# Altium project ESP32-ANALOG BOARD.PrjPcb
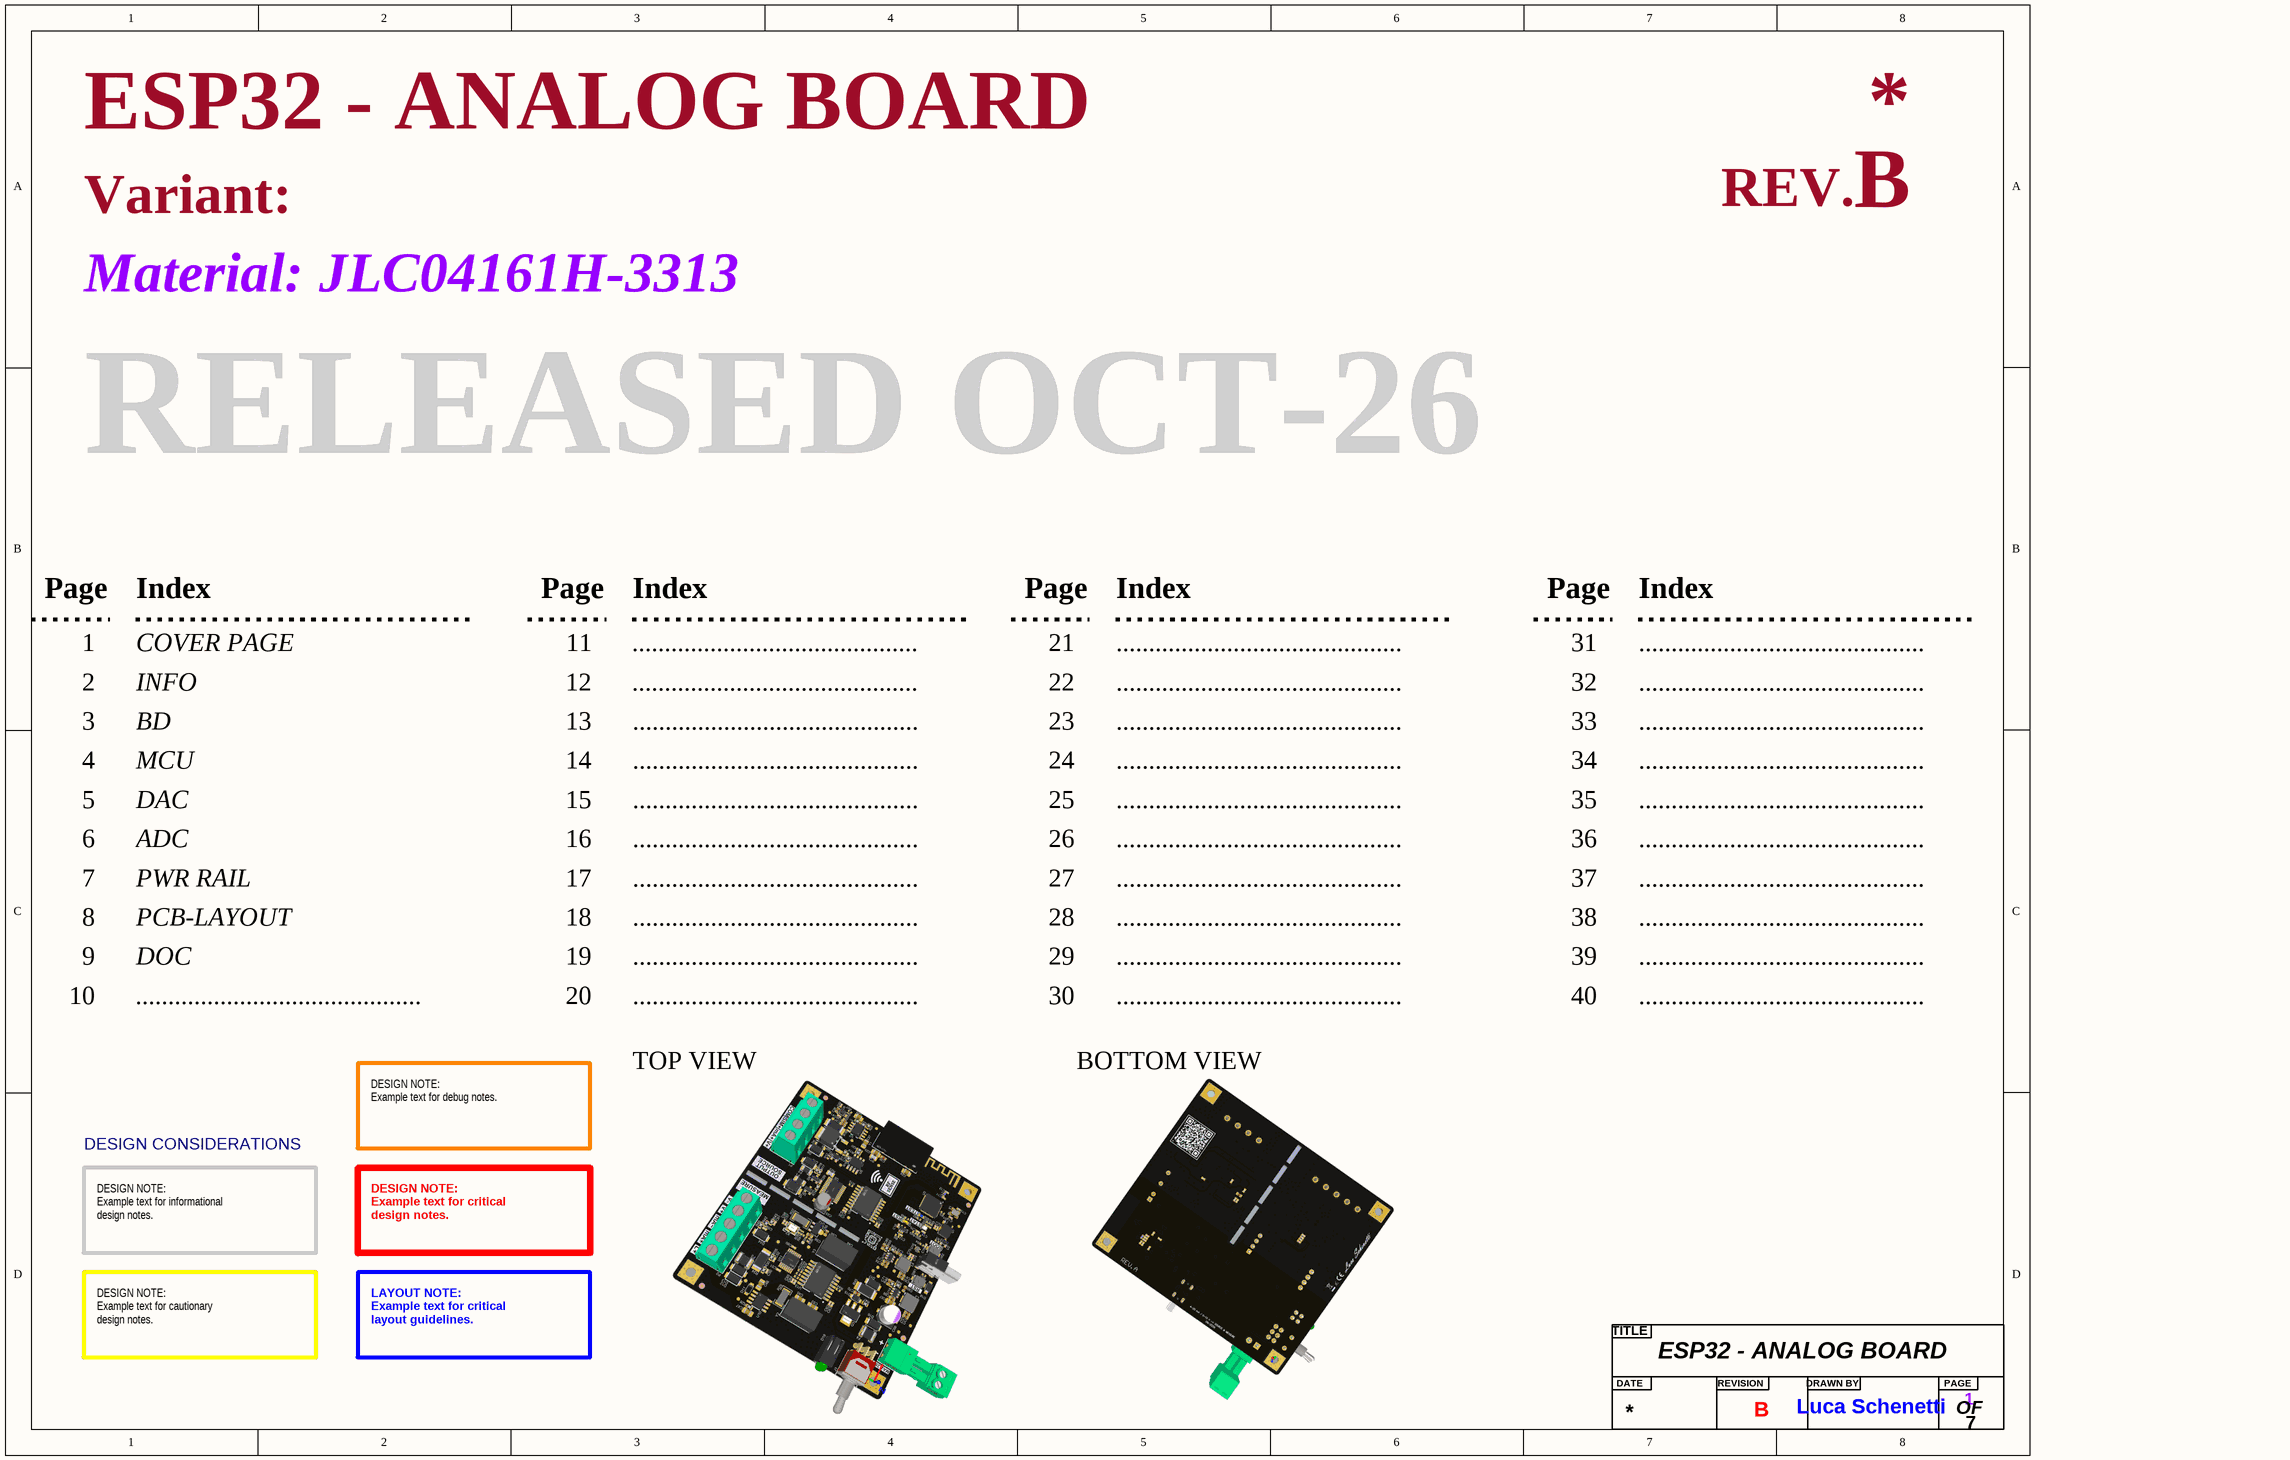
[diagram p0: COVER PAGE.SchDoc]
7 sheets, 231 parts. Net scope: flat (ports and power ports of the same name join across sheets).
Board file: PCB-LAYOUT.PcbDoc
Sheets:
  COVER PAGE.SchDoc
  INFO.SchDoc
  BD.SchDoc
  MCU.SchDoc
  DAC.SchDoc
  ADC.SchDoc
  PWR RAIL.SchDoc

## Sheet COVER PAGE.SchDoc: ESP32 - ANALOG BOARD
size A3; Author: Luca Schenetti; DrawnBy: Luca Schenetti; Engineer: Luca Schenetti; Revision: B; SheetNumber: 1; SheetTotal: 7; Material: JLC04161H-3313

### Parts
(Parts that share a designator on the sheet are numbered #1, #2 ... from top to bottom, then left to right.)
?#1  Title  (value not drawn)  (graphical)

### Notes on the sheet
- Variant:
- REV.
- Material:
- RELEASED OCT-26
- Page
- Index
- 1
- 2
- COVER PAGE
- INFO
- 11
- 12
- ............................................
- 21
- 22
- 31
- 32
- 3
- BD
- 13
- 23
- 33
- 4
- 5
- MCU
- DAC
- 14
- 15
- 24
- 25
- 34
- 35
- 6
- 7
- PWR RAIL
- ADC
- 16
- 17
- 26
- 27
- 36
- 37
- 8
- PCB-LAYOUT
- 18
- 28
- 38
- 9
- 10
- DOC
- 19
- 20
- 29
- 30
- 39
- 40
- TOP VIEW
- BOTTOM VIEW
- DESIGN CONSIDERATIONS
- DESIGN NOTE:
  Example text for debug notes.
- DESIGN NOTE:
  Example text for informational
  design notes.
- DESIGN NOTE:
  Example text for critical
  design notes.
- DESIGN NOTE:
  Example text for cautionary
  design notes.
- LAYOUT NOTE:
  Example text for critical
  layout guidelines.
- (in symbol Title) TITLE; DATE; REVISION; DRAWN BY; PAGE; OF

## Sheet INFO.SchDoc: ESP32 - ANALOG BOARD
size A3; Revision: B; Author: Luca Schenetti; DrawnBy: Luca Schenetti; SheetNumber: 2; SheetTotal: 7
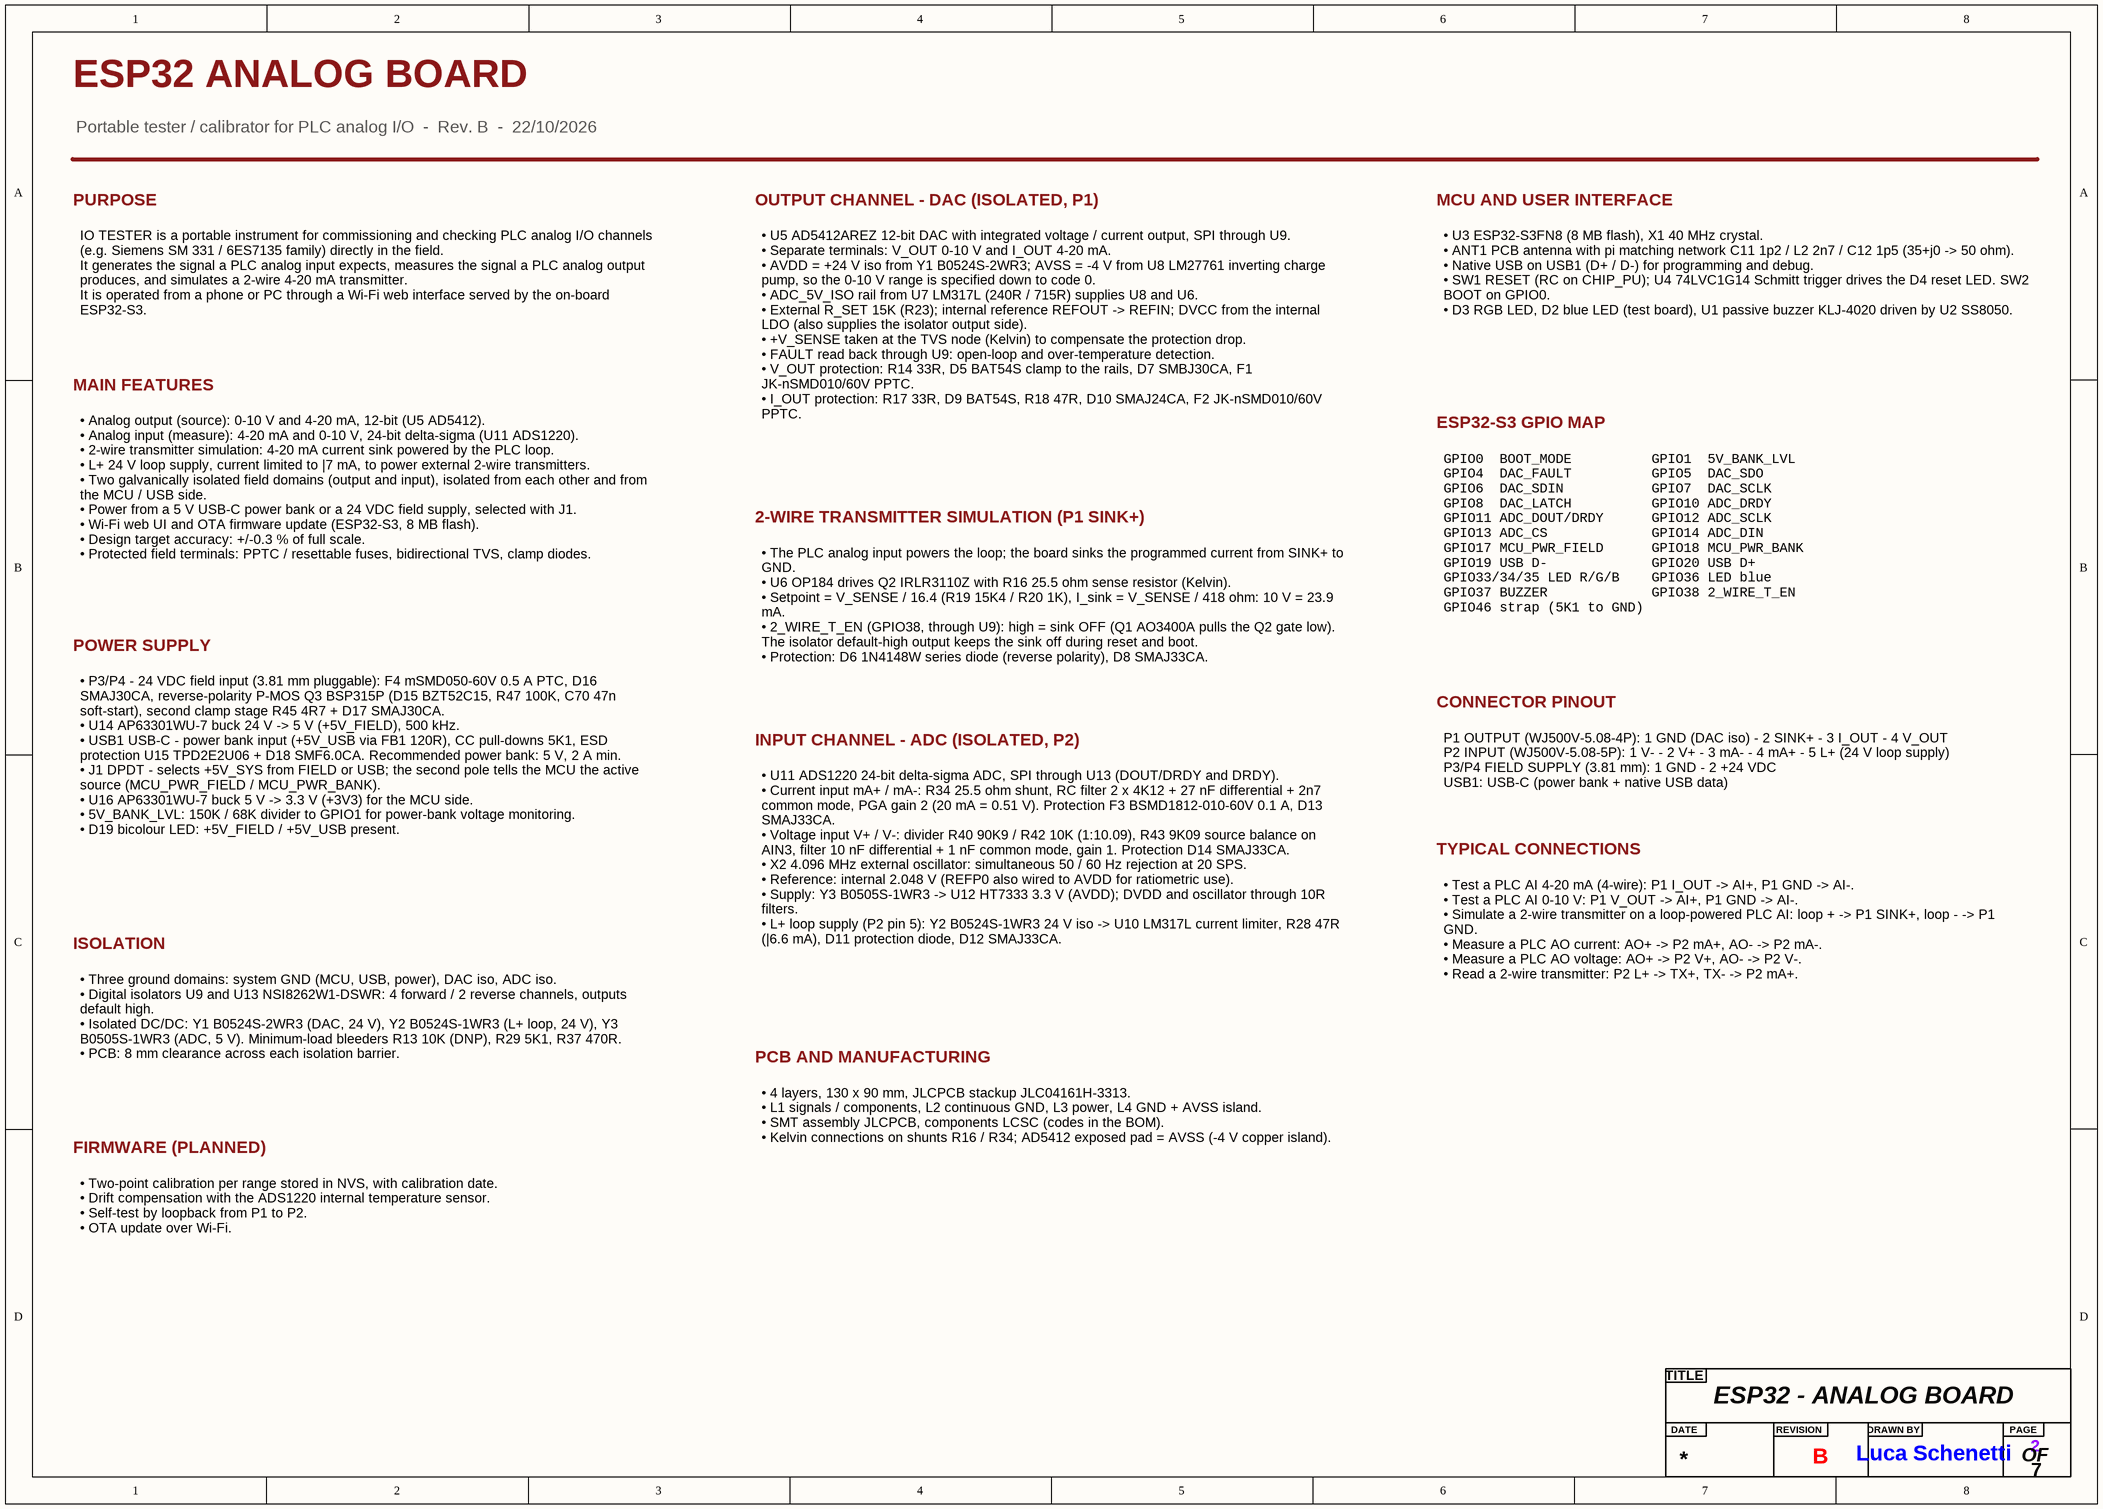
[diagram p1: INFO.SchDoc]

### Parts
(Parts that share a designator on the sheet are numbered #1, #2 ... from top to bottom, then left to right.)
?#2  Title  (value not drawn)  (graphical)

### Notes on the sheet
- ESP32 ANALOG BOARD
- Portable tester / calibrator for PLC analog I/O  -  Rev. B  -  22/10/2026
- PURPOSE
- OUTPUT CHANNEL - DAC (ISOLATED, P1)
- MCU AND USER INTERFACE
- IO TESTER is a portable instrument for commissioning and checking PLC analog I/O channels (e.g. Siemens SM 331 / 6ES7135 family) directly in the field.
  It generates the signal a PLC analog input expects, measures the signal a PLC analog output produces, and simulates a 2-wire 4-20 mA transmitter.
  It is operated from a phone or PC through a Wi-Fi web interface served by the on-board ESP32-S3.
- MAIN FEATURES
- • U3 ESP32-S3FN8 (8 MB flash), X1 40 MHz crystal.
  • ANT1 PCB antenna with pi matching network C11 1p2 / L2 2n7 / C12 1p5 (35+j0 -> 50 ohm).
  • Native USB on USB1 (D+ / D-) for programming and debug.
  • SW1 RESET (RC on CHIP_PU); U4 74LVC1G14 Schmitt trigger drives the D4 reset LED. SW2 BOOT on GPIO0.
  • D3 RGB LED, D2 blue LED (test board), U1 passive buzzer KLJ-4020 driven by U2 SS8050.
- ESP32-S3 GPIO MAP
- • U5 AD5412AREZ 12-bit DAC with integrated voltage / current output, SPI through U9.
  • Separate terminals: V_OUT 0-10 V and I_OUT 4-20 mA.
  • AVDD = +24 V iso from Y1 B0524S-2WR3; AVSS = -4 V from U8 LM27761 inverting charge pump, so the 0-10 V range is specified down to code 0.
  • ADC_5V_ISO rail from U7 LM317L (240R / 715R) supplies U8 and U6.
  • External R_SET 15K (R23); internal reference REFOUT -> REFIN; DVCC from the internal LDO (also supplies the isolator output side).
  • +V_SENSE taken at the TVS node (Kelvin) to compensate the protection drop.
  • FAULT read back through U9: open-loop and over-temperature detection.
  • V_OUT protection: R14 33R, D5 BAT54S clamp to the rails, D7 SMBJ30CA, F1 JK-nSMD010/60V PPTC.
  • I_OUT protection: R17 33R, D9 BAT54S, R18 47R, D10 SMAJ24CA, F2 JK-nSMD010/60V PPTC.
- 2-WIRE TRANSMITTER SIMULATION (P1 SINK+)
- • Analog output (source): 0-10 V and 4-20 mA, 12-bit (U5 AD5412).
  • Analog input (measure): 4-20 mA and 0-10 V, 24-bit delta-sigma (U11 ADS1220).
  • 2-wire transmitter simulation: 4-20 mA current sink powered by the PLC loop.
  • L+ 24 V loop supply, current limited to |7 mA, to power external 2-wire transmitters.
  • Two galvanically isolated field domains (output and input), isolated from each other and from the MCU / USB side.
  • Power from a 5 V USB-C power bank or a 24 VDC field supply, selected with J1.
  • Wi-Fi web UI and OTA firmware update (ESP32-S3, 8 MB flash).
  • Design target accuracy: +/-0.3 % of full scale.
  • Protected field terminals: PPTC / resettable fuses, bidirectional TVS, clamp diodes.
- POWER SUPPLY
- • The PLC analog input powers the loop; the board sinks the programmed current from SINK+ to GND.
  • U6 OP184 drives Q2 IRLR3110Z with R16 25.5 ohm sense resistor (Kelvin).
  • Setpoint = V_SENSE / 16.4 (R19 15K4 / R20 1K), I_sink = V_SENSE / 418 ohm: 10 V = 23.9 mA.
  • 2_WIRE_T_EN (GPIO38, through U9): high = sink OFF (Q1 AO3400A pulls the Q2 gate low). The isolator default-high output keeps the sink off during reset and boot.
  • Protection: D6 1N4148W series diode (reverse polarity), D8 SMAJ33CA.
- GPIO0  BOOT_MODE          GPIO1  5V_BANK_LVL
  GPIO4  DAC_FAULT          GPIO5  DAC_SDO
  GPIO6  DAC_SDIN           GPIO7  DAC_SCLK
  GPIO8  DAC_LATCH          GPIO10 ADC_DRDY
  GPIO11 ADC_DOUT/DRDY      GPIO12 ADC_SCLK
  GPIO13 ADC_CS             GPIO14 ADC_DIN
  GPIO17 MCU_PWR_FIELD      GPIO18 MCU_PWR_BANK
  GPIO19 USB D-             GPIO20 USB D+
  GPIO33/34/35 LED R/G/B    GPIO36 LED blue
  GPIO37 BUZZER             GPIO38 2_WIRE_T_EN
  GPIO46 strap (5K1 to GND)
- CONNECTOR PINOUT
- INPUT CHANNEL - ADC (ISOLATED, P2)
- P1 OUTPUT (WJ500V-5.08-4P): 1 GND (DAC iso) - 2 SINK+ - 3 I_OUT - 4 V_OUT
  P2 INPUT (WJ500V-5.08-5P): 1 V- - 2 V+ - 3 mA- - 4 mA+ - 5 L+ (24 V loop supply)
  P3/P4 FIELD SUPPLY (3.81 mm): 1 GND - 2 +24 VDC
  USB1: USB-C (power bank + native USB data)
- TYPICAL CONNECTIONS
- • P3/P4 - 24 VDC field input (3.81 mm pluggable): F4 mSMD050-60V 0.5 A PTC, D16 SMAJ30CA, reverse-polarity P-MOS Q3 BSP315P (D15 BZT52C15, R47 100K, C70 47n soft-start), second clamp stage R45 4R7 + D17 SMAJ30CA.
  • U14 AP63301WU-7 buck 24 V -> 5 V (+5V_FIELD), 500 kHz.
  • USB1 USB-C - power bank input (+5V_USB via FB1 120R), CC pull-downs 5K1, ESD protection U15 TPD2E2U06 + D18 SMF6.0CA. Recommended power bank: 5 V, 2 A min.
  • J1 DPDT - selects +5V_SYS from FIELD or USB; the second pole tells the MCU the active source (MCU_PWR_FIELD / MCU_PWR_BANK).
  • U16 AP63301WU-7 buck 5 V -> 3.3 V (+3V3) for the MCU side.
  • 5V_BANK_LVL: 150K / 68K divider to GPIO1 for power-bank voltage monitoring.
  • D19 bicolour LED: +5V_FIELD / +5V_USB present.
- ISOLATION
- • U11 ADS1220 24-bit delta-sigma ADC, SPI through U13 (DOUT/DRDY and DRDY).
  • Current input mA+ / mA-: R34 25.5 ohm shunt, RC filter 2 x 4K12 + 27 nF differential + 2n7 common mode, PGA gain 2 (20 mA = 0.51 V). Protection F3 BSMD1812-010-60V 0.1 A, D13 SMAJ33CA.
  • Voltage input V+ / V-: divider R40 90K9 / R42 10K (1:10.09), R43 9K09 source balance on AIN3, filter 10 nF differential + 1 nF common mode, gain 1. Protection D14 SMAJ33CA.
  • X2 4.096 MHz external oscillator: simultaneous 50 / 60 Hz rejection at 20 SPS.
  • Reference: internal 2.048 V (REFP0 also wired to AVDD for ratiometric use).
  • Supply: Y3 B0505S-1WR3 -> U12 HT7333 3.3 V (AVDD); DVDD and oscillator through 10R filters.
  • L+ loop supply (P2 pin 5): Y2 B0524S-1WR3 24 V iso -> U10 LM317L current limiter, R28 47R (|6.6 mA), D11 protection diode, D12 SMAJ33CA.
- • Test a PLC AI 4-20 mA (4-wire): P1 I_OUT -> AI+, P1 GND -> AI-.
  • Test a PLC AI 0-10 V: P1 V_OUT -> AI+, P1 GND -> AI-.
  • Simulate a 2-wire transmitter on a loop-powered PLC AI: loop + -> P1 SINK+, loop - -> P1 GND.
  • Measure a PLC AO current: AO+ -> P2 mA+, AO- -> P2 mA-.
  • Measure a PLC AO voltage: AO+ -> P2 V+, AO- -> P2 V-.
  • Read a 2-wire transmitter: P2 L+ -> TX+, TX- -> P2 mA+.
- • Three ground domains: system GND (MCU, USB, power), DAC iso, ADC iso.
  • Digital isolators U9 and U13 NSI8262W1-DSWR: 4 forward / 2 reverse channels, outputs default high.
  • Isolated DC/DC: Y1 B0524S-2WR3 (DAC, 24 V), Y2 B0524S-1WR3 (L+ loop, 24 V), Y3 B0505S-1WR3 (ADC, 5 V). Minimum-load bleeders R13 10K (DNP), R29 5K1, R37 470R.
  • PCB: 8 mm clearance across each isolation barrier.
- PCB AND MANUFACTURING
- FIRMWARE (PLANNED)
- • 4 layers, 130 x 90 mm, JLCPCB stackup JLC04161H-3313.
  • L1 signals / components, L2 continuous GND, L3 power, L4 GND + AVSS island.
  • SMT assembly JLCPCB, components LCSC (codes in the BOM).
  • Kelvin connections on shunts R16 / R34; AD5412 exposed pad = AVSS (-4 V copper island).
- • Two-point calibration per range stored in NVS, with calibration date.
  • Drift compensation with the ADS1220 internal temperature sensor.
  • Self-test by loopback from P1 to P2.
  • OTA update over Wi-Fi.
- (in symbol Title) TITLE; DATE; REVISION; DRAWN BY; PAGE; OF

## Sheet BD.SchDoc: ESP32 - ANALOG BOARD
size A3; Author: Luca Schenetti; DrawnBy: Luca Schenetti; Revision: B; SheetNumber: 2; SheetTotal: 6
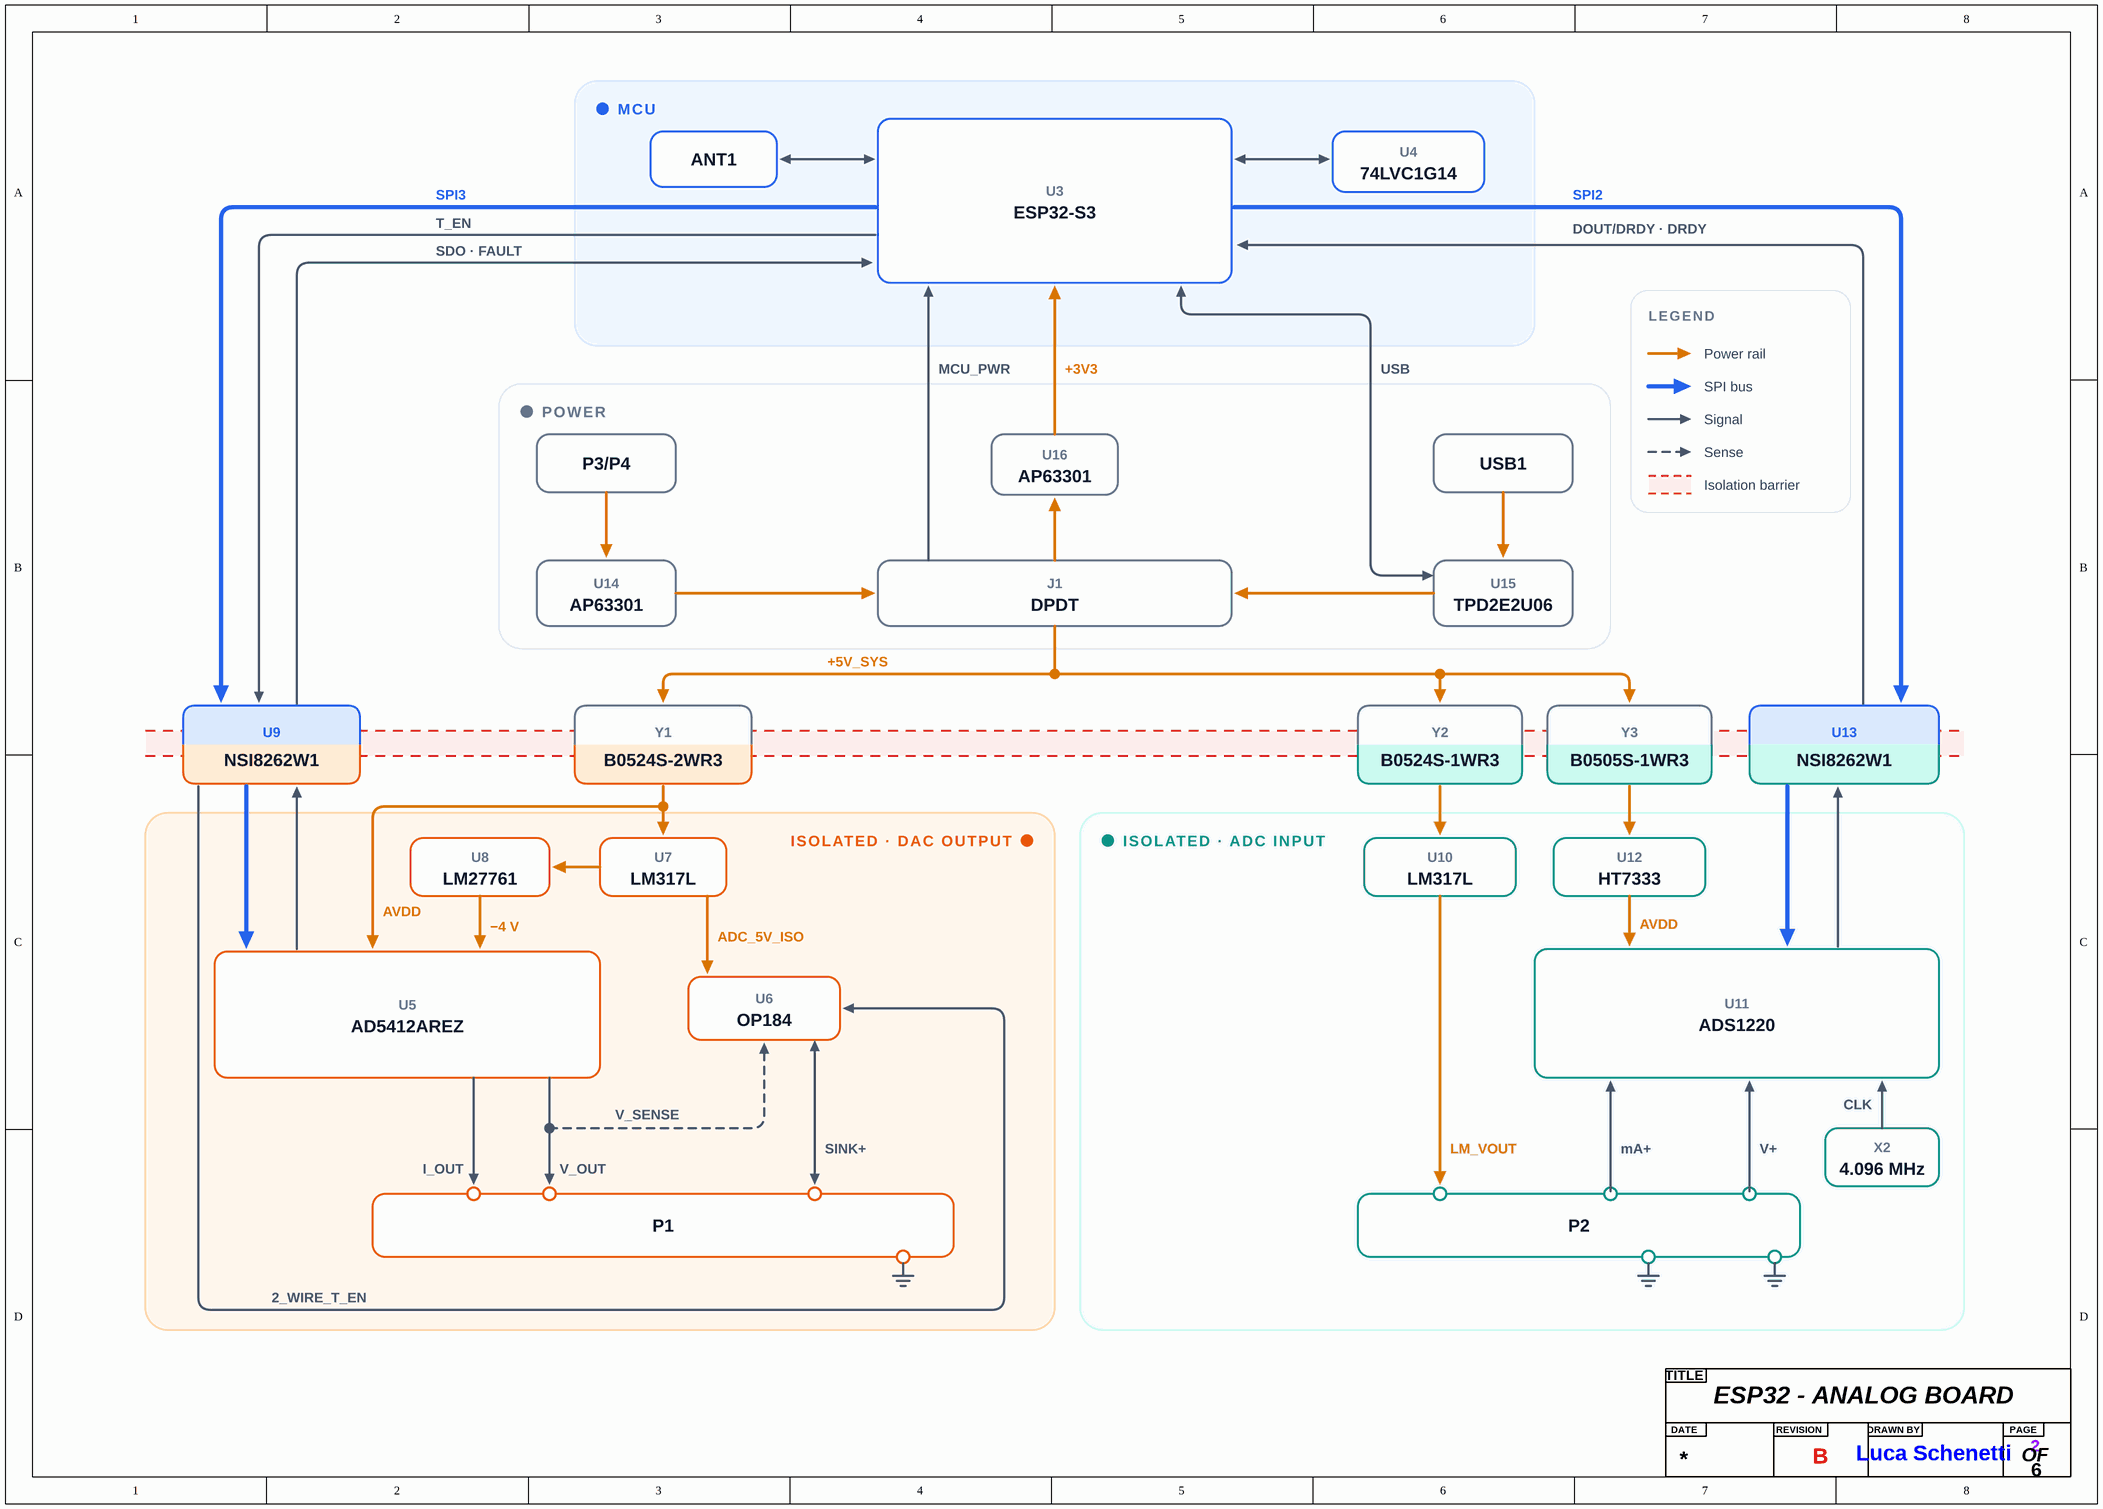
[diagram p2: BD.SchDoc]

### Parts
(Parts that share a designator on the sheet are numbered #1, #2 ... from top to bottom, then left to right.)
?#3  Title  (value not drawn)  (graphical)

### Notes on the sheet
- (in symbol Title) TITLE; DATE; REVISION; DRAWN BY; PAGE; OF

## Sheet MCU.SchDoc: ESP32 - ANALOG BOARD
size A3; Author: Luca Schenetti; DrawnBy: Luca Schenetti; Engineer: Luca Schenetti; Revision: B; SheetNumber: 2; SheetTotal: 5
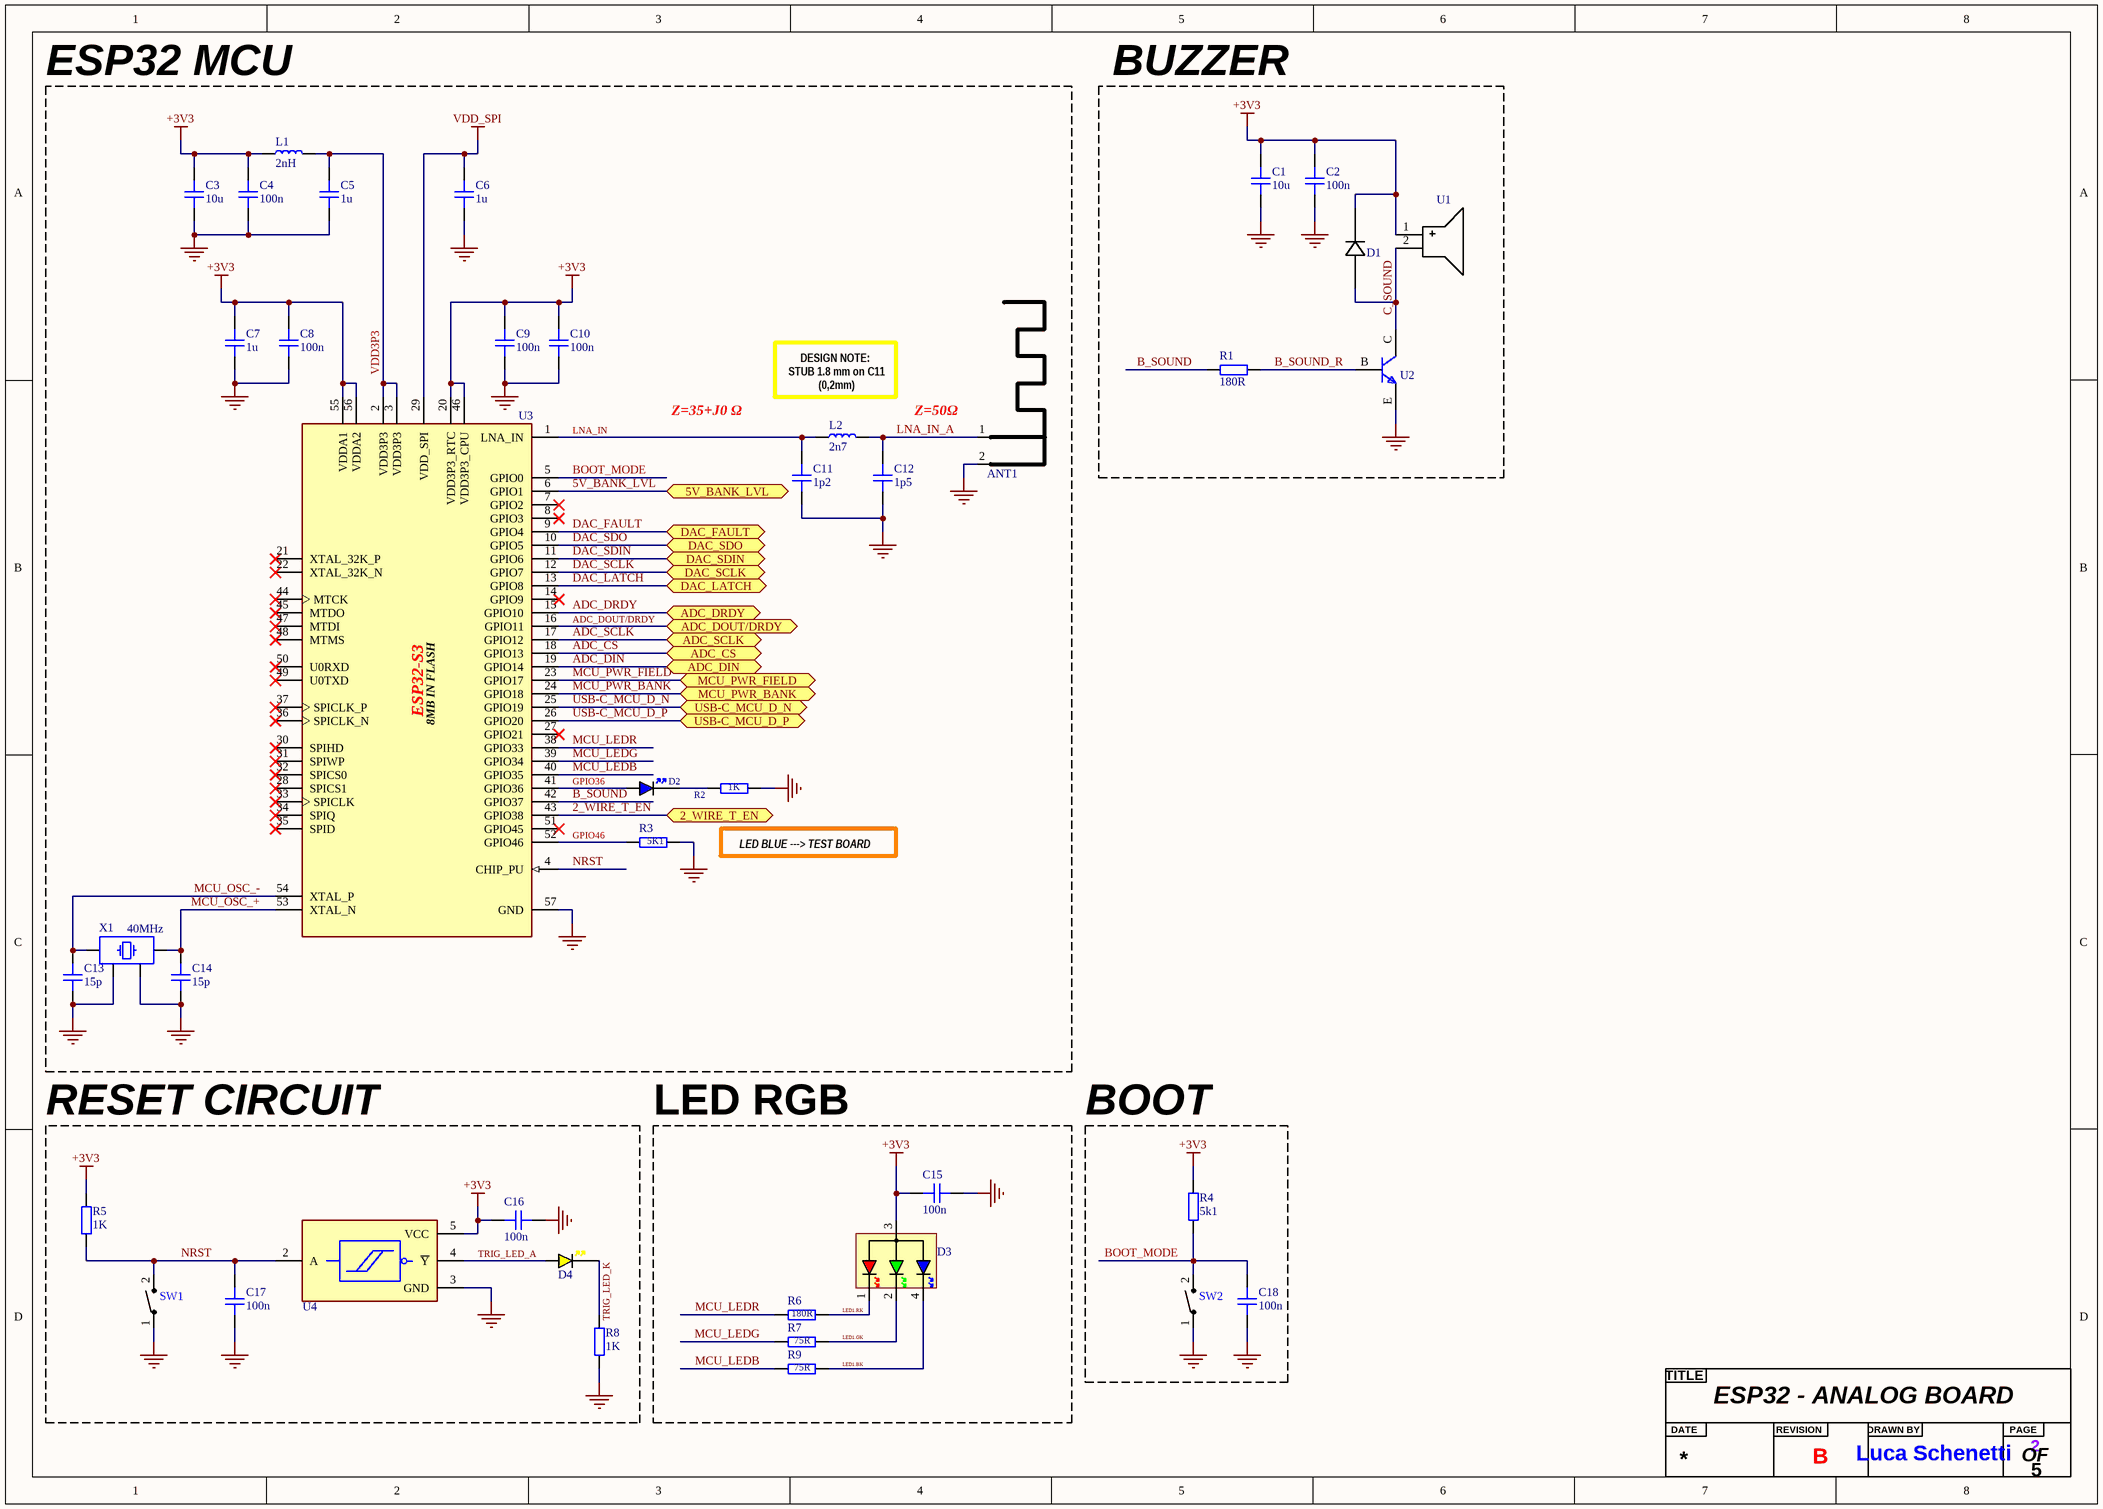
[diagram p3: MCU.SchDoc]

### Parts
(Parts that share a designator on the sheet are numbered #1, #2 ... from top to bottom, then left to right.)
?#4  Title  (value not drawn)  (graphical)
ANT1  PCB Antenna 2.4GHz 50Ohm  [ANT_IFA_USB_2_4GHZ_50R]  (value not drawn)  (no BOM)
C1  10u  [CAP_0402]
C2  100n  [CAP_0402]
C3  10u  [CAP_0402]
C4  100n  [CAP_0402]
C5  1u  [CAP_0402]
C6  1u  [CAP_0402]
C7  1u  [CAP_0402]
C8  100n  [CAP_0402]
C9  100n  [CAP_0402]
C10  100n  [CAP_0402]
C11  1p2  [CAP_0402]
C12  1p5  [CAP_0402]
C13  15p  [CAP_0402]
C14  15p  [CAP_0402]
C15  100n  [CAP_0402]
C16  100n  [CAP_0402]
C17  100n  [CAP_0402]
C18  100n  [CAP_0402]
D1  DIODE 300mA 75V  [1N4148W]  (value not drawn)
D2  BLUE  [LED_0603_BLUE]  (value not drawn)
D3  RGB_LED  [XL-2012RGBC]  (value not drawn)
D4  YELLOW  [LED_0603_YELLOW]  (value not drawn)
L1  2nH  [IND_0402]
L2  2n7  [IND_0402]
R1  180R  [RES_0402]
R2  1K  [RES_0402]
R3  5K1  [RES_0402]
R4  5k1  [RES_0402]
R5  1K  [RES_0402]
R6  180R  [RES_0402]
R7  75R  [RES_0402]
R8  1K  [RES_0402]
R9  75R  [RES_0402]
SW1  TS-1088-AR02016  [TS-1088-AR02016]  (value not drawn)
SW2  TS-1088-AR02016  [TS-1088-AR02016]  (value not drawn)
U1  Passive Buzzer 4kHz  [KLJ-4020]  (value not drawn)
U2  TRANSISTOR NPN  [SS8050]  (value not drawn)
U3  ESP32-S3 8MB IN FLASH  [ESP32-S3FN8]  (value not drawn)
U4  Schmitt Trigger 1.65V~5.5V  [74LVC1G14GW,125]  (value not drawn)
X1  40MHz  [XTAL_3225]

### Blocks framed on the sheet
ESP32 MCU: ANT1 C3-C14 D2 L1 L2 R2 R3 U3 X1
BUZZER: C1 C2 D1 R1 U1 U2
RESET CIRCUIT: C16 C17 D4 R5 R8 SW1 U4
LED RGB: C15 D3 R6 R7 R9
BOOT: C18 R4 SW2

### Ports
2_WIRE_T_EN (bidir, see DAC[6B]), 5V_BANK_LVL (bidir, see PWR RAIL[4C]), ADC_CS (bidir, see ADC[5B]), ADC_DIN (bidir, see ADC[5B]), ADC_DOUT/DRDY (bidir, see ADC[5C]), ADC_DRDY (bidir, see ADC[5C]), ADC_SCLK (bidir, see ADC[5B]), DAC_FAULT (bidir, see DAC[6C]), DAC_LATCH (bidir, see DAC[6B]), DAC_SCLK (bidir, see DAC[6B]), DAC_SDIN (bidir, see DAC[6B]), DAC_SDO (bidir, see DAC[6C]), MCU_PWR_BANK (bidir, see PWR RAIL[6B]), MCU_PWR_FIELD (bidir, see PWR RAIL[6B]), USB-C_MCU_D_N (bidir, see PWR RAIL[3C]), USB-C_MCU_D_P (bidir, see PWR RAIL[3C])

### Nets
+3V3: C1.2 C2.2 C3.2 C4.2 C7.2 C8.2 C9.2 C10.2 C15.2 C16.2 D1.1(C) D3.3(AC) L1.1 R4.2 R5.2 U1.1(+) U3.20(VDD3P3_RTC) U3.46(VDD3P3_CPU) U3.55(VDDA1) U3.56(VDDA2) U4.5(VCC)
GND: ANT1.2(GND) C1.1 C2.1 C3.1 C4.1 C5.1 C6.1 C7.1 C8.1 C9.1 C10.1 C11.1 C12.1 C13.1 C14.1 C15.1 C16.1 C17.1 C18.1 R2.1 R3.1 R8.1 SW1.1 SW2.1 U2.E U3.57(GND) U4.3(GND) X1.2 X1.4
VDD_SPI: C6.2 U3.29(VDD_SPI)
2_WIRE_T_EN: U3.43(GPIO38) ; port 2_WIRE_T_EN
5V_BANK_LVL: U3.6(GPIO1) ; port 5V_BANK_LVL
ADC_CS: U3.18(GPIO13) ; port ADC_CS
ADC_DIN: U3.19(GPIO14) ; port ADC_DIN
ADC_DOUT/DRDY: U3.16(GPIO11) ; port ADC_DOUT/DRDY
ADC_DRDY: U3.15(GPIO10) ; port ADC_DRDY
ADC_SCLK: U3.17(GPIO12) ; port ADC_SCLK
B_SOUND: R1.1 U3.42(GPIO37)
B_SOUND_R: R1.2 U2.B
BOOT_MODE: C18.2 R4.1 SW2.2 U3.5(GPIO0)
C_SOUND: D1.2(A) U1.2(-) U2.C
DAC_FAULT: U3.9(GPIO4) ; port DAC_FAULT
DAC_LATCH: U3.13(GPIO8) ; port DAC_LATCH
DAC_SCLK: U3.12(GPIO7) ; port DAC_SCLK
DAC_SDIN: U3.11(GPIO6) ; port DAC_SDIN
DAC_SDO: U3.10(GPIO5) ; port DAC_SDO
GPIO36: D2.A U3.41(GPIO36)
GPIO46: R3.2 U3.52(GPIO46)
LED1.BK: D3.4(CB) R9.2
LED1.GK: D3.2(CG) R7.2
LED1.RK: D3.1(CR) R6.2
LNA_IN: C11.2 L2.1 U3.1(LNA_IN)
LNA_IN_A: ANT1.1(RF) C12.2 L2.2
MCU_LEDB: R9.1 U3.40(GPIO35)
MCU_LEDG: R7.1 U3.39(GPIO34)
MCU_LEDR: R6.1 U3.38(GPIO33)
MCU_OSC_+: C14.2 U3.53(XTAL_N) X1.1
MCU_OSC_-: C13.2 U3.54(XTAL_P) X1.3
MCU_PWR_BANK: U3.24(GPIO18) ; port MCU_PWR_BANK
MCU_PWR_FIELD: U3.23(GPIO17) ; port MCU_PWR_FIELD
NRST: C17.2 R5.1 SW1.2 U3.4(CHIP_PU) U4.2(A)
TRIG_LED_A: D4.A U4.4(~{Y})
TRIG_LED_K: D4.K R8.2
USB-C_MCU_D_N: U3.25(GPIO19) ; port USB-C_MCU_D_N
USB-C_MCU_D_P: U3.26(GPIO20) ; port USB-C_MCU_D_P
VDD3P3: C5.2 L1.2 U3.2(VDD3P3) U3.3(VDD3P3)
NetD2_K: D2.K R2.2

Not connected (* = marked no-connect by the designer): U3 7(GPIO2)* 8(GPIO3)* 14(GPIO9)* 21(XTAL_32K_P)* 22(XTAL_32K_N)* 27(GPIO21)* 28(SPICS1)* 30(SPIHD)* 31(SPIWP)* 32(SPICS0)* 33(SPICLK)* 34(SPIQ)* 35(SPID)* 36(SPICLK_N)* 37(SPICLK_P)* 44(MTCK)* 45(MTDO)* 47(MTDI)* 48(MTMS)* 49(U0TXD)* 50(U0RXD)* 51(GPIO45)*

### Notes on the sheet
- Z=35+J0 Ω
- (near L2) DESIGN NOTE:
  STUB 1.8 mm on C11
  (0,2mm)
- Z=50Ω
- LED BLUE ---> TEST BOARD
- (in symbol ESP32-S3FN8) ESP32-S3; 8MB IN FLASH
- (in symbol Title) TITLE; DATE; REVISION; DRAWN BY; PAGE; OF

### Library data of the parts
ANT1 = ANT_IFA_USB_2_4GHZ_50R: Inverted F 2.4GHz ISM PCB Antenna 50 Ohm; ComponentLink1Description: Datasheet; ComponentLink1URL: https://www.ti.com/lit/an/swra117d/swra117d.pdf
C1 C3 = CAP_0402: [C15525]; Manufacturer: *; Manufacturer Part Number: *; Distributor Link: *; LCSC: *; Rating: *; Dielectric: *
C2 C4 C8-C10 C15-C18 = CAP_0402: [C307331]; Manufacturer: *; Manufacturer Part Number: *; Distributor Link: *; LCSC: *; Rating: *; Dielectric: *
C5-C7 = CAP_0402: [C52923]; Manufacturer: *; Manufacturer Part Number: *; Distributor Link: *; LCSC: *; Rating: *; Dielectric: *
C11 = CAP_0402: [C76899]; Manufacturer: *; Manufacturer Part Number: *; Distributor Link: *; LCSC: *; Rating: *; Dielectric: *
C12 = CAP_0402: [C76900]; Manufacturer: *; Manufacturer Part Number: *; Distributor Link: *; LCSC: *; Rating: *; Dielectric: *
C13 C14 = CAP_0402: Capacitor SMD 0402 [C1548]; Manufacturer: *; Manufacturer Part Number: *; Distributor Link: *; LCSC: *; Rating: *; Dielectric: *
D1 = 1N4148W: [C917030]
D2 = LED_0603_BLUE: [C965807]
D3 = RGB_LED_0805: [C965848]
D4 = LED_0603_YELLOW: [C89811]
L1 = IND_0402: [C18216]
L2 = IND_0402: [C77108]
R1 R6 = RES_0402: [C138045]; Manufacturer: *; Manufacturer Part Number: *; Distributor Link: *; LCSC: *
R2 R5 R8 = RES_0402: [C11702]; Manufacturer: *; Manufacturer Part Number: *; Distributor Link: *; LCSC: *
R3 R4 = RES_0402: [C25905]; Manufacturer: *; Manufacturer Part Number: *; Distributor Link: *; LCSC: *
R7 R9 = RES_0402: [C25133]; Manufacturer: *; Manufacturer Part Number: *; Distributor Link: *; LCSC: *
SW1 SW2 = TS-1088-AR02016: [C720477]; Manufacturer: XUNPU(讯普); Add into BOM: yes; Circuit: SPST; Actuator Style: Round Button; Operating Force: 160gf; Switch Length: 4mm; Switch Width: 3mm; Switch Height: 2mm; Strike Gundam: 不带; Contact Current: 50mA; Voltage Rating (DC): 12V; Insulation Resistance: 100MΩ; Actuator/Cap Color: Black; Pin Style: SMDSplicing; Mechanical Life: 10万次; Symbol: TS-1088-AR02016; Device: TS-1088-AR02016; Supplier: LCSC; Supplier Part: C720477; Manufacturer Part: TS-1088-AR02016; JLCPCB Part Class: Extended Part; LCSC Part Name: 4*3*2mm 立贴 轻触开关; Supplier Footprint: SMD; Datasheet: https://atta.szlcsc.com/upload/public/pdf/source/20200810/C720475_60D09DD6C54279ADDB2DC25100F1CC11.pdf; Convert to PCB: yes; Mounting Style: Brick nogging; Operating Temperature: -30℃~+80℃
U1 = KLJ-4020: [C556936]
U2 = SS8050: [C2150]
U3 = ESP32-S3FN8: [C2913196]
U4 = 74LVC1G14GW,125: [C265125]
X1 = TSX-3225_24.0000MF15X-AC: [C5261245]; Manufacturer: Epson; Manufacturer Part Number: TSX-3225 24.0000MF15X-AC

## Sheet DAC.SchDoc: ESP32 - ANALOG BOARD
size A2; Author: Luca Schenetti; DrawnBy: Luca Schenetti; Engineer: Luca Schenetti; Revision: B; SheetNumber: 5; SheetTotal: 7
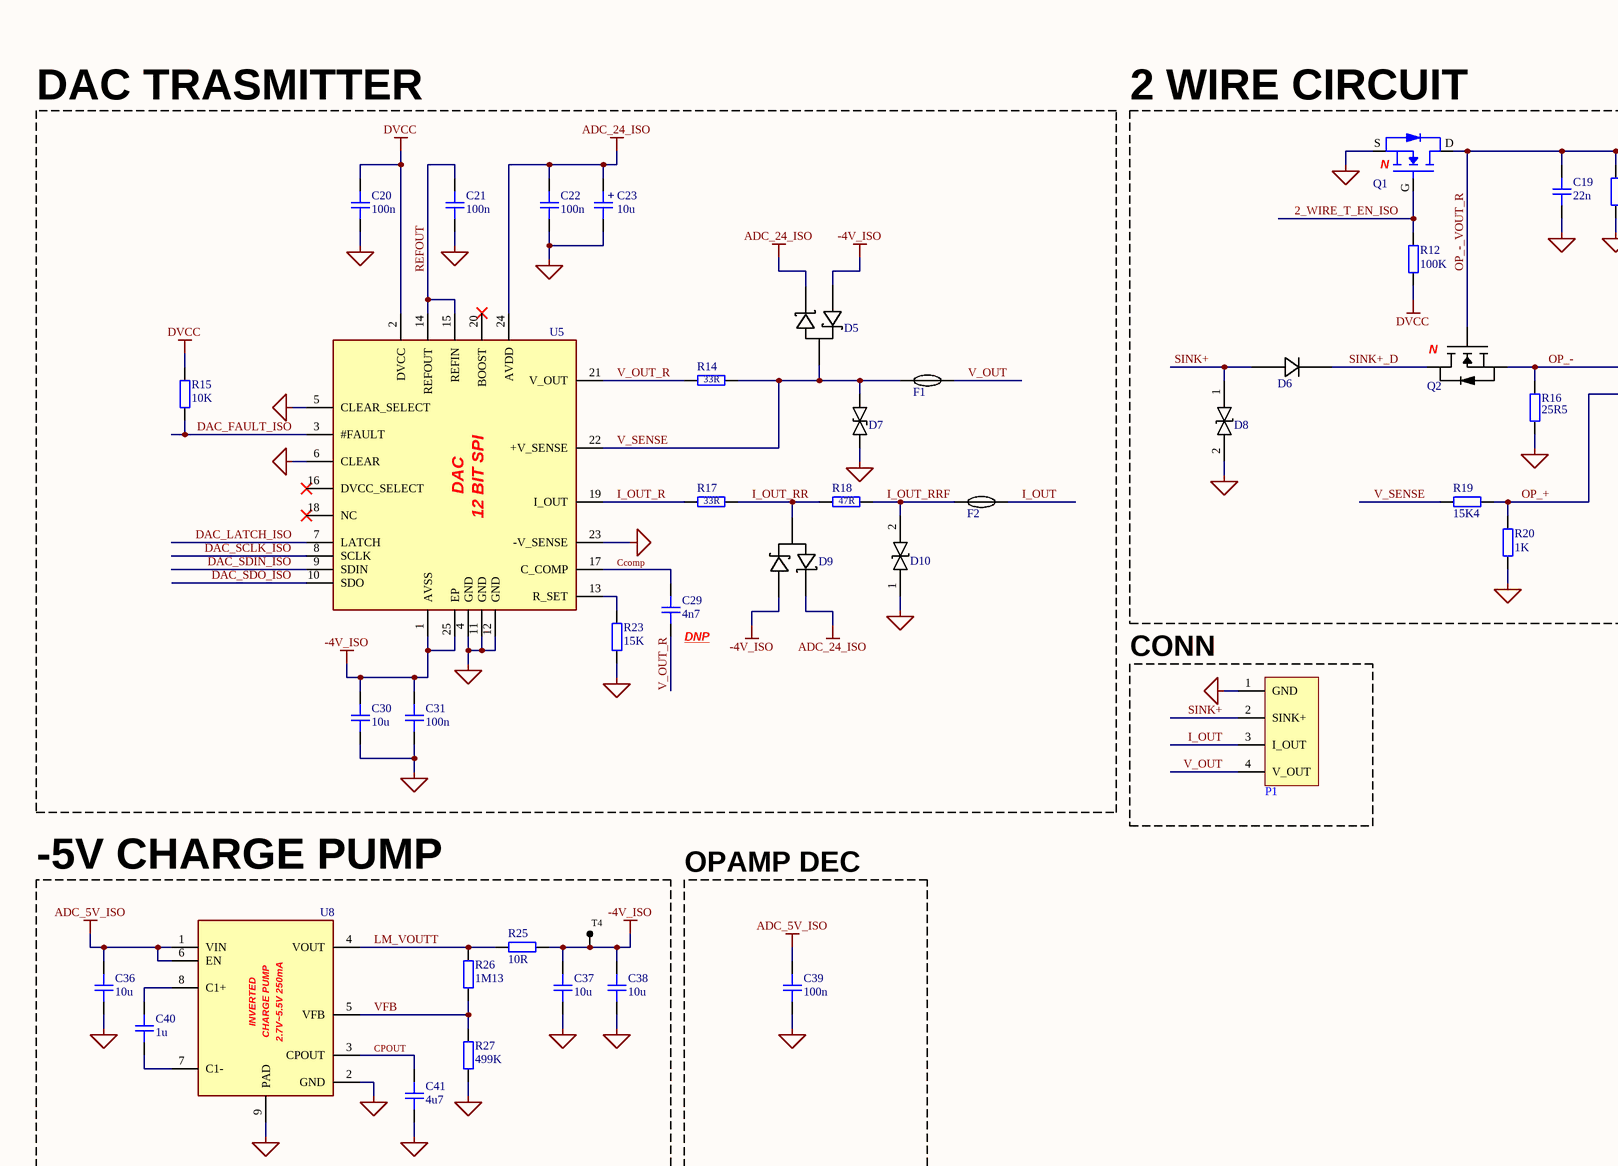
[diagram p4: DAC.SchDoc, top left]
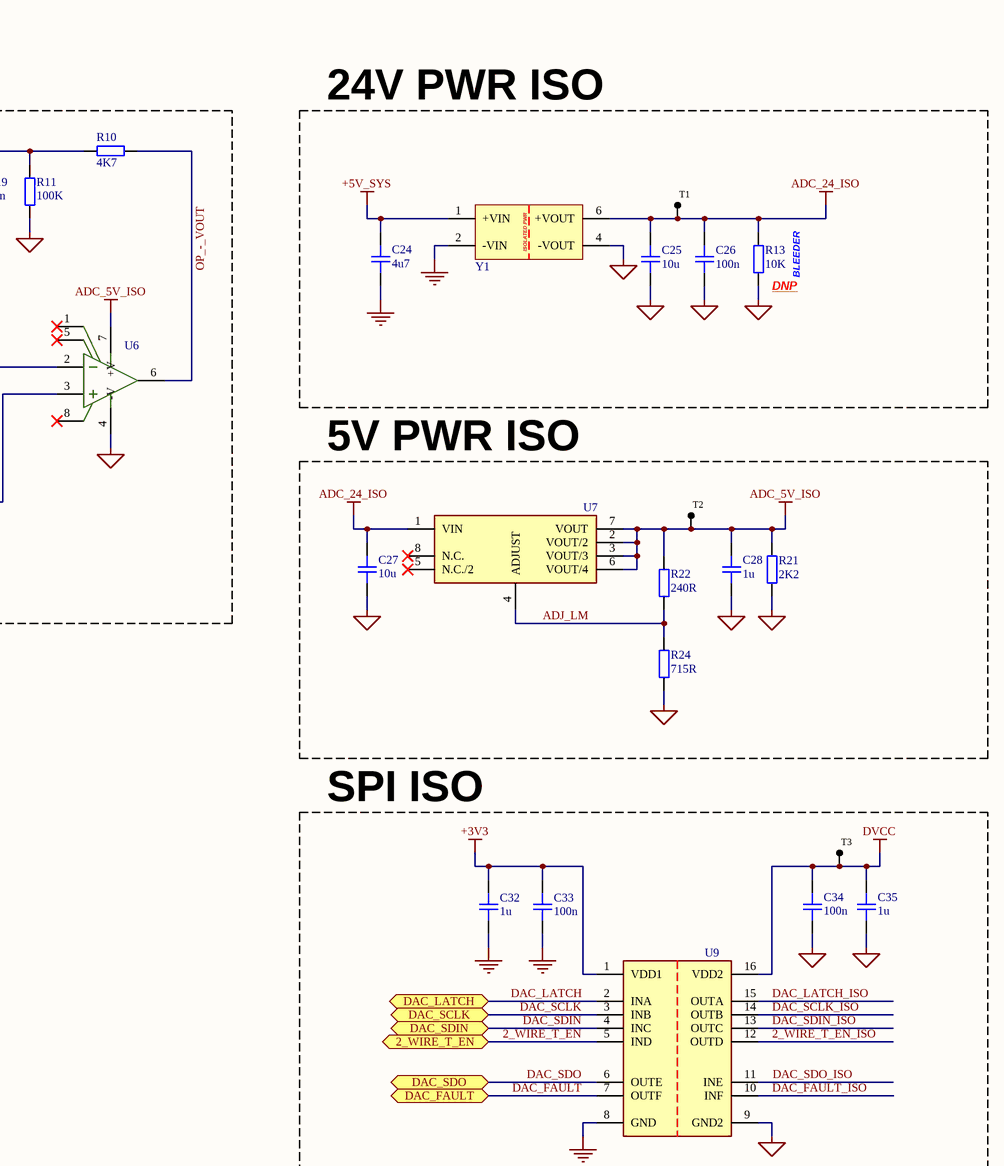
[diagram p5: DAC.SchDoc, top middle]
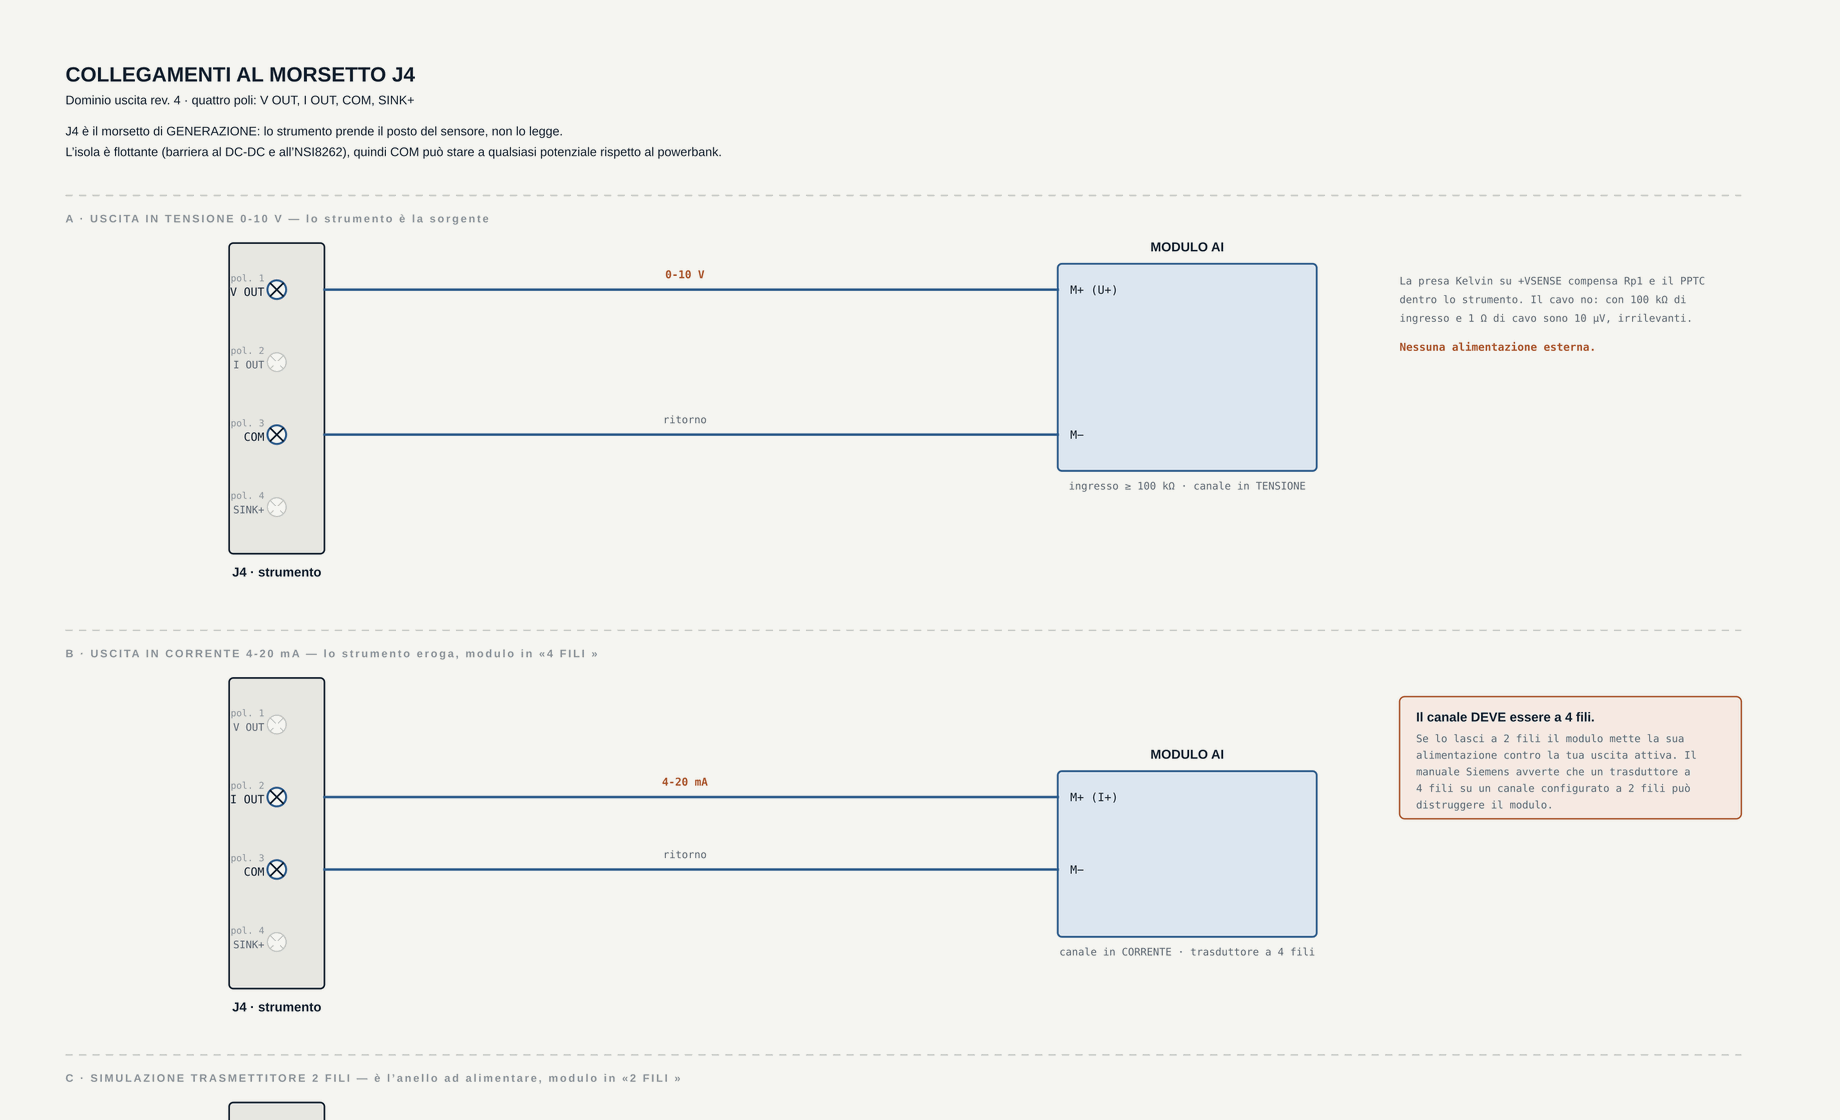
[diagram p6: DAC.SchDoc, top right]
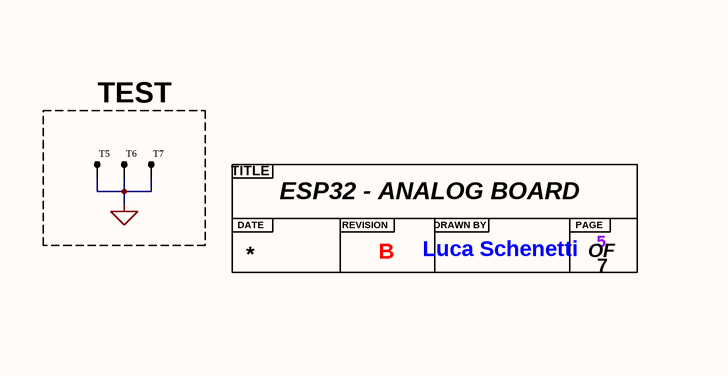
[diagram p7: DAC.SchDoc, bottom middle]
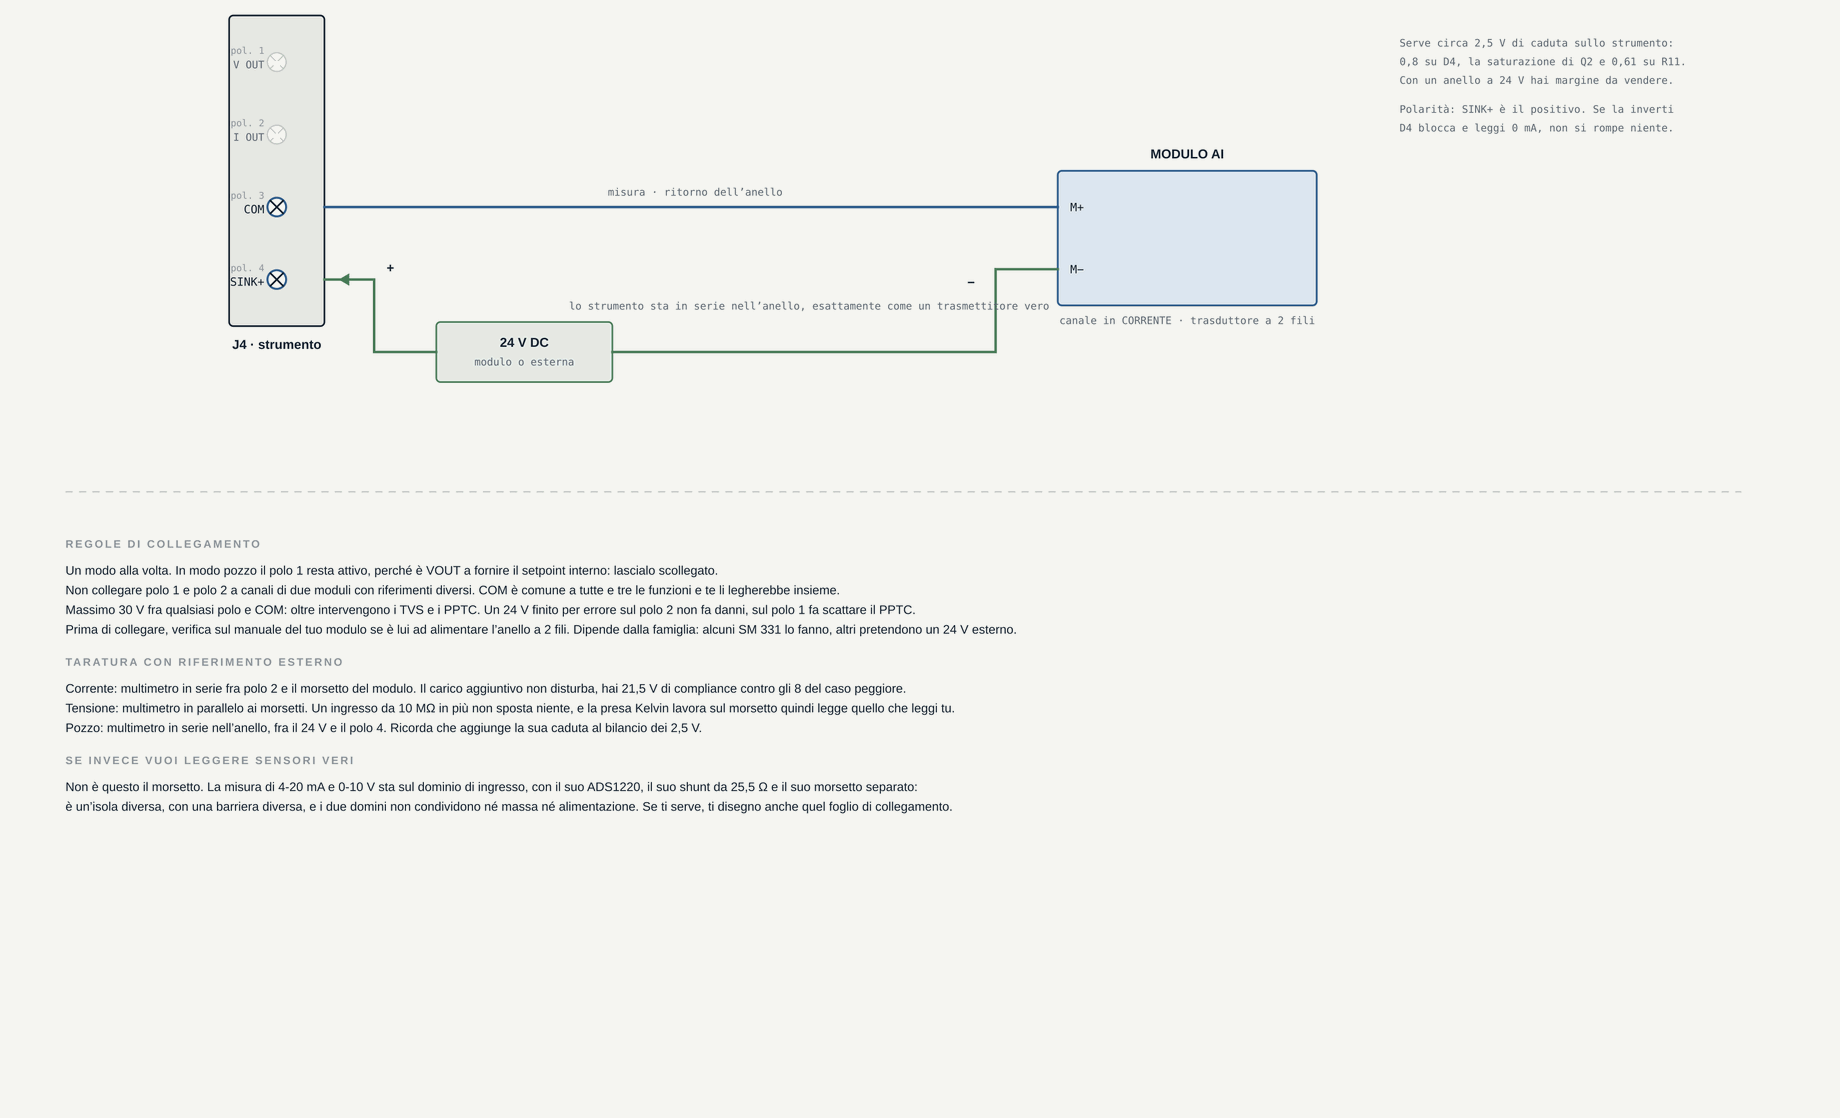
[diagram p8: DAC.SchDoc, bottom right]

### Parts
(Parts that share a designator on the sheet are numbered #1, #2 ... from top to bottom, then left to right.)
?#5  Title  (value not drawn)  (graphical)
C19  22n  [CAP_0402]
C20  100n  [CAP_0402]
C21  100n  [CAP_0402]
C22  100n  [CAP_0402]
C23  10u  [CAP_ALEL_5x5.4]
C24  4u7  [CAP_0805]
C25  10u  [CAP_0805]
C26  100n  [CAP_0603]
C27  10u  [CAP_0805]
C28  1u  [CAP_0805]
C29  4n7  [CAP_0402]  (no BOM)
C30  10u  [CAP_0603]
C31  100n  [CAP_0402]
C32  1u  [CAP_0402]
C33  100n  [CAP_0402]
C34  100n  [CAP_0402]
C35  1u  [CAP_0402]
C36  10u  [CAP_0603]
C37  10u  [CAP_0603]
C38  10u  [CAP_0603]
C39  100n  [CAP_0402]
C40  1u  [CAP_0402]
C41  4u7  [CAP_0402]
D5  Schottky Diodes  [BAT54S]  (value not drawn)
D6  DIODE 300mA 75V  [1N4148W]  (value not drawn)
D7  TVS 30V Bidirectional  [SMBJ30CA]  (value not drawn)
D8  BIDI TVS 36V  [SMAJ33CA]  (value not drawn)
D9  Schottky Diodes  [BAT54S]  (value not drawn)
D10  BIDI TVS 30V  [SMAJ30CA]  (value not drawn)
F1  PPTC 100mA 60V  [JK-nSMD010/60V]  (value not drawn)
F2  PPTC 100mA 60V  [JK-nSMD010/60V]  (value not drawn)
P1  WJ500V-5.08-4P  [WJ500V-5.08-4P]  (value not drawn)
Q1  N-Channel Vgs=30V 5.7A  [AO3400A]  (value not drawn)
Q2  NPN MOSFET 100V  [IRLR3110ZTRPBF]  (value not drawn)
R10  4K7  [RES_0603]
R11  100K  [RES_0603]
R12  100K  [RES_0402]
R13  10K  [RES_0805]
R14  33R  [RES_0603]
R15  10K  [RES_0402]
R16  25R5  [RES_2512]
R17  33R  [RES_0603]
R18  47R  [RES_0603]
R19  15K4  [RES_0603]
R20  1K  [RES_0603]
R21  2K2  [RES_0603]
R22  240R  [RES_0603]
R23  15K  [RES_0805]
R24  715R  [RES_0603]
R25  10R  [RES_0402]
R26  1M13  [RES_0402]
R27  499K  [RES_0402]
T1  TP_S  [TP 1mm]  (value not drawn)  (no BOM)
T2  TP_S  [TP 1mm]  (value not drawn)  (no BOM)
T3  TP_S  [TP 1mm]  (value not drawn)  (no BOM)
T4  TP_S  [TP 1mm]  (value not drawn)  (no BOM)
T5  TP_S  [TP 1mm]  (value not drawn)  (no BOM)
T6  TP_S  [TP 1mm]  (value not drawn)  (no BOM)
T7  TP_S  [TP 1mm]  (value not drawn)  (no BOM)
U5  Digital to Analog Converters 12 SPI Voltage Buffer  [AD5412AREZ-REEL7]  (value not drawn)
U6  Precision Op Amps  [OP184ESZ-REEL7]  (value not drawn)
U7  LDO 100mA 2,2-37V  [LM317LDR2G]  (value not drawn)
U8  INVERTED CHARGE PUMP 2.7V~5.5V  [LM27761DSGR]  (value not drawn)
U9  Digital Isolators 4 IN - 2 OUT  [NSI8262W1-DSWR]  (value not drawn)
Y1  Isolated Power IN 4.5V~5.5V OUT 24V 2W  [B0524S-2WR3]  (value not drawn)

### Blocks framed on the sheet
DAC TRASMITTER: C20-C23 C29-C31 D5 D7 D9 D10 F1 F2 R14 R15 R17 R18 R23 U5
2 WIRE CIRCUIT: C19 D6 D8 Q1 Q2 R10-R12 R16 R19 R20 U6
24V PWR ISO: C24-C26 R13 T1 Y1
5V PWR ISO: C27 C28 R21 R22 R24 T2 U7
SPI ISO: C32-C35 T3 U9
-5V CHARGE PUMP: C36-C38 C40 C41 R25-R27 T4 U8
OPAMP DEC: C39
TEST: T5-T7

### Ports
2_WIRE_T_EN (bidir, see MCU[3C]), DAC_FAULT (bidir, see MCU[3B]), DAC_LATCH (bidir, see MCU[3B]), DAC_SCLK (bidir, see MCU[3B]), DAC_SDIN (bidir, see MCU[3B]), DAC_SDO (bidir, see MCU[3B])

### Nets
+3V3: C32.2 C33.2 U9.1(VDD1)
+5V_SYS: C24.2 Y1.1(+VIN)
-4V_ISO: C30.2 C31.2 C37.2 C38.2 D5.1(K1) D9.1(K1) R25.2 T4.1 U5.1(AVSS) U5.25(EP)
ADC_5V_ISO: C28.2 C36.2 C39.2 R21.2 R22.2 T2.1 U6.7(+V) U7.2(VOUT/2) U7.3(VOUT/3) U7.6(VOUT/4) U7.7(VOUT) U8.1(VIN) U8.6(EN)
ADC_24_ISO: C22.2 C23.1 C25.2 C26.2 C27.1 D5.2(K2) D9.2(K2) R13.2 T1.1 U5.24(AVDD) U7.1(VIN) Y1.6(+VOUT)
DVCC: C20.2 C34.2 C35.2 R12.1 R15.2 T3.1 U5.2(DVCC) U9.16(VDD2)
GND: C24.1 C32.1 C33.1 U9.8(GND) Y1.2(-VIN)
GND_2: C19.1 C20.1 C21.1 C22.1 C23.2 C25.1 C26.1 C27.2 C28.1 C30.1 C31.1 C34.1 C35.1 C36.1 C37.1 C38.1 C39.1 C41.1 D7.2(A) D8.2 D10.1 P1.1(GND) Q1.S R11.2 R13.1 R16.2 R20.1 R21.1 R23.1 R24.1 R27.1 T5.1 T6.1 T7.1 U5.4(GND) U5.5(CLEAR_SELECT) U5.6(CLEAR) U5.11(GND) U5.12(GND) U5.23(-V_SENSE) U6.4(-V) U8.2(GND) U8.9(PAD) U9.9(GND2) Y1.4(-VOUT)
2_WIRE_T_EN: U9.5(IND) ; port 2_WIRE_T_EN
2_WIRE_T_EN_ISO: Q1.G R12.2 U9.12(OUTD)
ADJ_LM: R22.1 R24.2 U7.4(ADJUST)
Ccomp: C29.2 U5.17(C_COMP)
CPOUT: C41.2 U8.3(CPOUT)
DAC_FAULT: U9.7(OUTF) ; port DAC_FAULT
DAC_FAULT_ISO: R15.1 U5.3(#FAULT) U9.10(INF)
DAC_LATCH: U9.2(INA) ; port DAC_LATCH
DAC_LATCH_ISO: U5.7(LATCH) U9.15(OUTA)
DAC_SCLK: U9.3(INB) ; port DAC_SCLK
DAC_SCLK_ISO: U5.8(SCLK) U9.14(OUTB)
DAC_SDIN: U9.4(INC) ; port DAC_SDIN
DAC_SDIN_ISO: U5.9(SDIN) U9.13(OUTC)
DAC_SDO: U9.6(OUTE) ; port DAC_SDO
DAC_SDO_ISO: U5.10(SDO) U9.11(INE)
I_OUT: F2.2 P1.3(I_OUT)
I_OUT_R: R17.1 U5.19(I_OUT)
I_OUT_RR: D9.3(A) R17.2 R18.1
I_OUT_RRF: D10.2 F2.1 R18.2
LM_VOUTT: R25.1 R26.2 U8.4(VOUT)
OP_+: R19.1 R20.2 U6.3(+IN_A)
OP_-: Q2.3(S) R16.1 U6.2(-IN_A)
OP_-_VOUT: R10.1 U6.6(OUT_A)
OP_-_VOUT_R: C19.2 Q1.D Q2.1(G) R10.2 R11.1
REFOUT: C21.2 U5.14(REFOUT) U5.15(REFIN)
SINK+: D6.2(A) D8.1 P1.2(SINK+)
SINK+_D: D6.1(C) Q2.2(D)
V_OUT: F1.2 P1.4(V_OUT)
V_OUT_R: C29.1 R14.1 U5.21(V_OUT)
V_SENSE: D5.3(A) D7.1(K) F1.1 R14.2 R19.2 U5.22(+V_SENSE)
VFB: R26.1 R27.2 U8.5(VFB)
NetC40_1: C40.1 U8.7(C1-)
NetC40_2: C40.2 U8.8(C1+)
NetR23_2: R23.2 U5.13(R_SET)

Not connected (* = marked no-connect by the designer): U5 16(DVCC_SELECT)* 18(NC)* 20(BOOST)*; U6 1(DNC)* 5(DNC)* 8(NC)*; U7 5(N.C./2)* 8(N.C.)*

### Notes on the sheet
- (near R13) DNP
- (near R13) BLEEDER
- (near C29) DNP
- CONN
- (in symbol AD5412AREZ-REEL7) DAC; 12 BIT SPI
- (in symbol AO3400A) N
- (in symbol B0524S-2WR3) ISOLATED PWR
- (in symbol CAP_ALEL_5x5.4) +
- (in symbol IRLR3110ZTRPBF) N
- (in symbol LM27761DSGR) INVERTED; CHARGE PUMP; 2.7V~5.5V 250mA
- (in symbol Title) TITLE; DATE; REVISION; DRAWN BY; PAGE; OF

### Library data of the parts
C19 = CAP_0402: [C1532]; Manufacturer: *; Manufacturer Part Number: *; Distributor Link: *; LCSC: *; Rating: *; Dielectric: *
C20-C22 C31 C33 C34 C39 = CAP_0402: [C307331]; Manufacturer: *; Manufacturer Part Number: *; Distributor Link: *; LCSC: *; Rating: *; Dielectric: *
C23 = CAP_ALEL_5x5.4: [C46550416]; Manufacturer: *; Manufacturer Part Number: *; Distributor Link: *; LCSC: *
C24 = CAP_0805: [C98192]; Manufacturer: *; Manufacturer Part Number: *; Distributor Link: *; LCSC: *; Rating: *; Dielectric: *
C25 C27 = CAP_0805: [C440198]; Manufacturer: *; Manufacturer Part Number: *; Distributor Link: *; LCSC: *; Rating: *; Dielectric: *
C26 = CAP_0603: [C307331]; Manufacturer: *; Manufacturer Part Number: *; Distributor Link: *; LCSC: *; Rating: *; Dielectric: *
C28 = CAP_0805: [C28323]; Manufacturer: *; Manufacturer Part Number: *; Distributor Link: *; LCSC: *; Rating: *; Dielectric: *
C29 = CAP_0402: [C1538]; Manufacturer: *; Manufacturer Part Number: *; Distributor Link: *; LCSC: *; Rating: *; Dielectric: *
C30 C36-C38 = CAP_0603: [C19702]; Manufacturer: *; Manufacturer Part Number: *; Distributor Link: *; LCSC: *; Rating: *; Dielectric: *
C32 C35 C40 = CAP_0402: [C52923]; Manufacturer: *; Manufacturer Part Number: *; Distributor Link: *; LCSC: *; Rating: *; Dielectric: *
C41 = CAP_0402: [C23733]; Manufacturer: *; Manufacturer Part Number: *; Distributor Link: *; LCSC: *; Rating: *; Dielectric: *
D5 D9 = BAT54S_C7420333: [C7420333]
D6 = 1N4148W: [C917030]
D7 = SMBJ30CA: [C83847]
D8 = SMAJ33CA: [C19077549]
D10 = SMAJ30CA: [C10755]
F1 F2 = JK-nSMD010/60V: [C2830236]
P1 = WJ500V-5.08-4P: [C2915641]; Manufacturer: KANGNEX(康奈克斯电气); Symbol: WJ500V-5.08-3P-14-00A; Device: WJ500V-5.08-3P; Add into BOM: yes; Structure: 1x3P; Pitch: 5.08mm; Current Rating (Max): 18A; Voltage Rating (Max): 250V; Wire Gauge - AWG: 14~30; Wire Gauge - mm2: 2.5; Number of PINs Per Row: 3; LCSC Part Name: 5.08mm 1x3P 排数:1 每排P数:3 直插; Supplier Part: C72334; Manufacturer Part: WJ500V-5.08-3P; Supplier Footprint: 插件,P=5.08mm; JLCPCB Part Class: Extended Part; Datasheet: https://atta.szlcsc.com/upload/public/pdf/source/20191225/C72334_8A5EF831D67650233B6B1E3F2BC06274.pdf; Supplier: LCSC; Convert to PCB: yes; Color: Green; Mounting Style: Straight; Number of Pins: 3P; Number of Rows: 1; Operating Temperature Range: -40℃~+105℃
Q1 = AO3400A: [C20917]
Q2 = IRLR3110ZTRPBF: [C67277]
R10 = RES_0603: [C23162]; Manufacturer: *; Manufacturer Part Number: *; Distributor Link: *; LCSC: *
R11 = RES_0603: [C25803]; Manufacturer: *; Manufacturer Part Number: *; Distributor Link: *; LCSC: *
R12 = RES_0402: [C25741]; Manufacturer: *; Manufacturer Part Number: *; Distributor Link: *; LCSC: *
R13 = RES_0805: [C17414]; Manufacturer: *; Manufacturer Part Number: *; Distributor Link: *; LCSC: *
R14 R17 = RES_0603: [C23140]; Manufacturer: *; Manufacturer Part Number: *; Distributor Link: *; LCSC: *
R15 = RES_0402: [C25744]; Manufacturer: *; Manufacturer Part Number: *; Distributor Link: *; LCSC: *
R16 = RES_2512: [C2775912]
R18 = RES_0603: [C23182]; Manufacturer: *; Manufacturer Part Number: *; Distributor Link: *; LCSC: *
R19 = RES_0603: [C2933150]; Manufacturer: *; Manufacturer Part Number: *; Distributor Link: *; LCSC: *
R20 = RES_0603: [C21190]; Manufacturer: *; Manufacturer Part Number: *; Distributor Link: *; LCSC: *
R21 = RES_0603: [C4190]; Manufacturer: *; Manufacturer Part Number: *; Distributor Link: *; LCSC: *
R22 = RES_0603: [C23350]; Manufacturer: *; Manufacturer Part Number: *; Distributor Link: *; LCSC: *
R23 = RES_0805: [C17475]; Manufacturer: *; Manufacturer Part Number: *; Distributor Link: *; LCSC: *
R24 = RES_0603: [C2998136]; Manufacturer: *; Manufacturer Part Number: *; Distributor Link: *; LCSC: *
R25 = RES_0402: [C25077]; Manufacturer: *; Manufacturer Part Number: *; Distributor Link: *; LCSC: *
R26 = RES_0402: [C51048313]; Manufacturer: *; Manufacturer Part Number: *; Distributor Link: *; LCSC: *
R27 = RES_0402: [C2998054]; Manufacturer: *; Manufacturer Part Number: *; Distributor Link: *; LCSC: *
T1-T7 = TP_S: test point
U5 = AD5412AREZ-REEL7: [C27993]
U6 = OP184ESZ-REEL7: [C209423]
U7 = LM317LDR2G: [C7940]
U8 = LM27761DSGR: [C129351]
U9 = NSI8262W1-DSWR: [C5441133]
Y1 = B0524S-2WR3: [C5369477]

## Sheet ADC.SchDoc: ESP32 - ANALOG BOARD
size A2; Author: Luca Schenetti; DrawnBy: Luca Schenetti; Revision: B; SheetNumber: 5; SheetTotal: 5
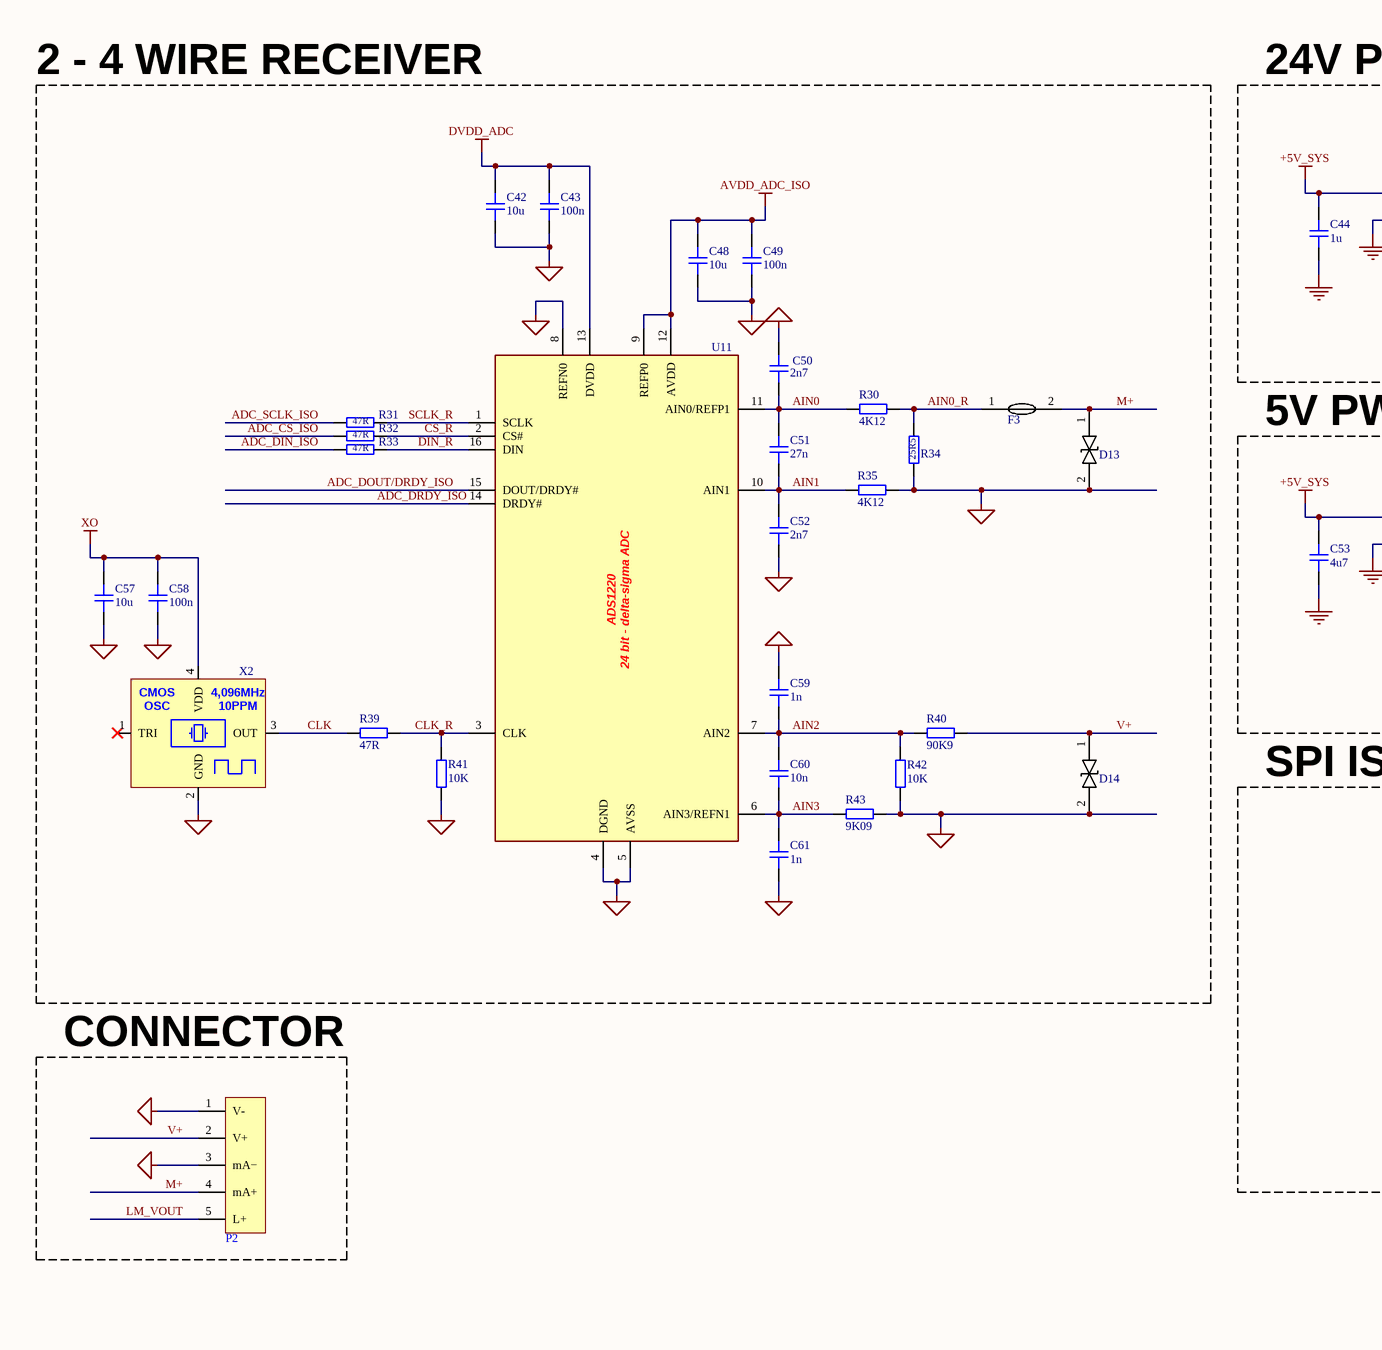
[diagram p9: ADC.SchDoc, left]
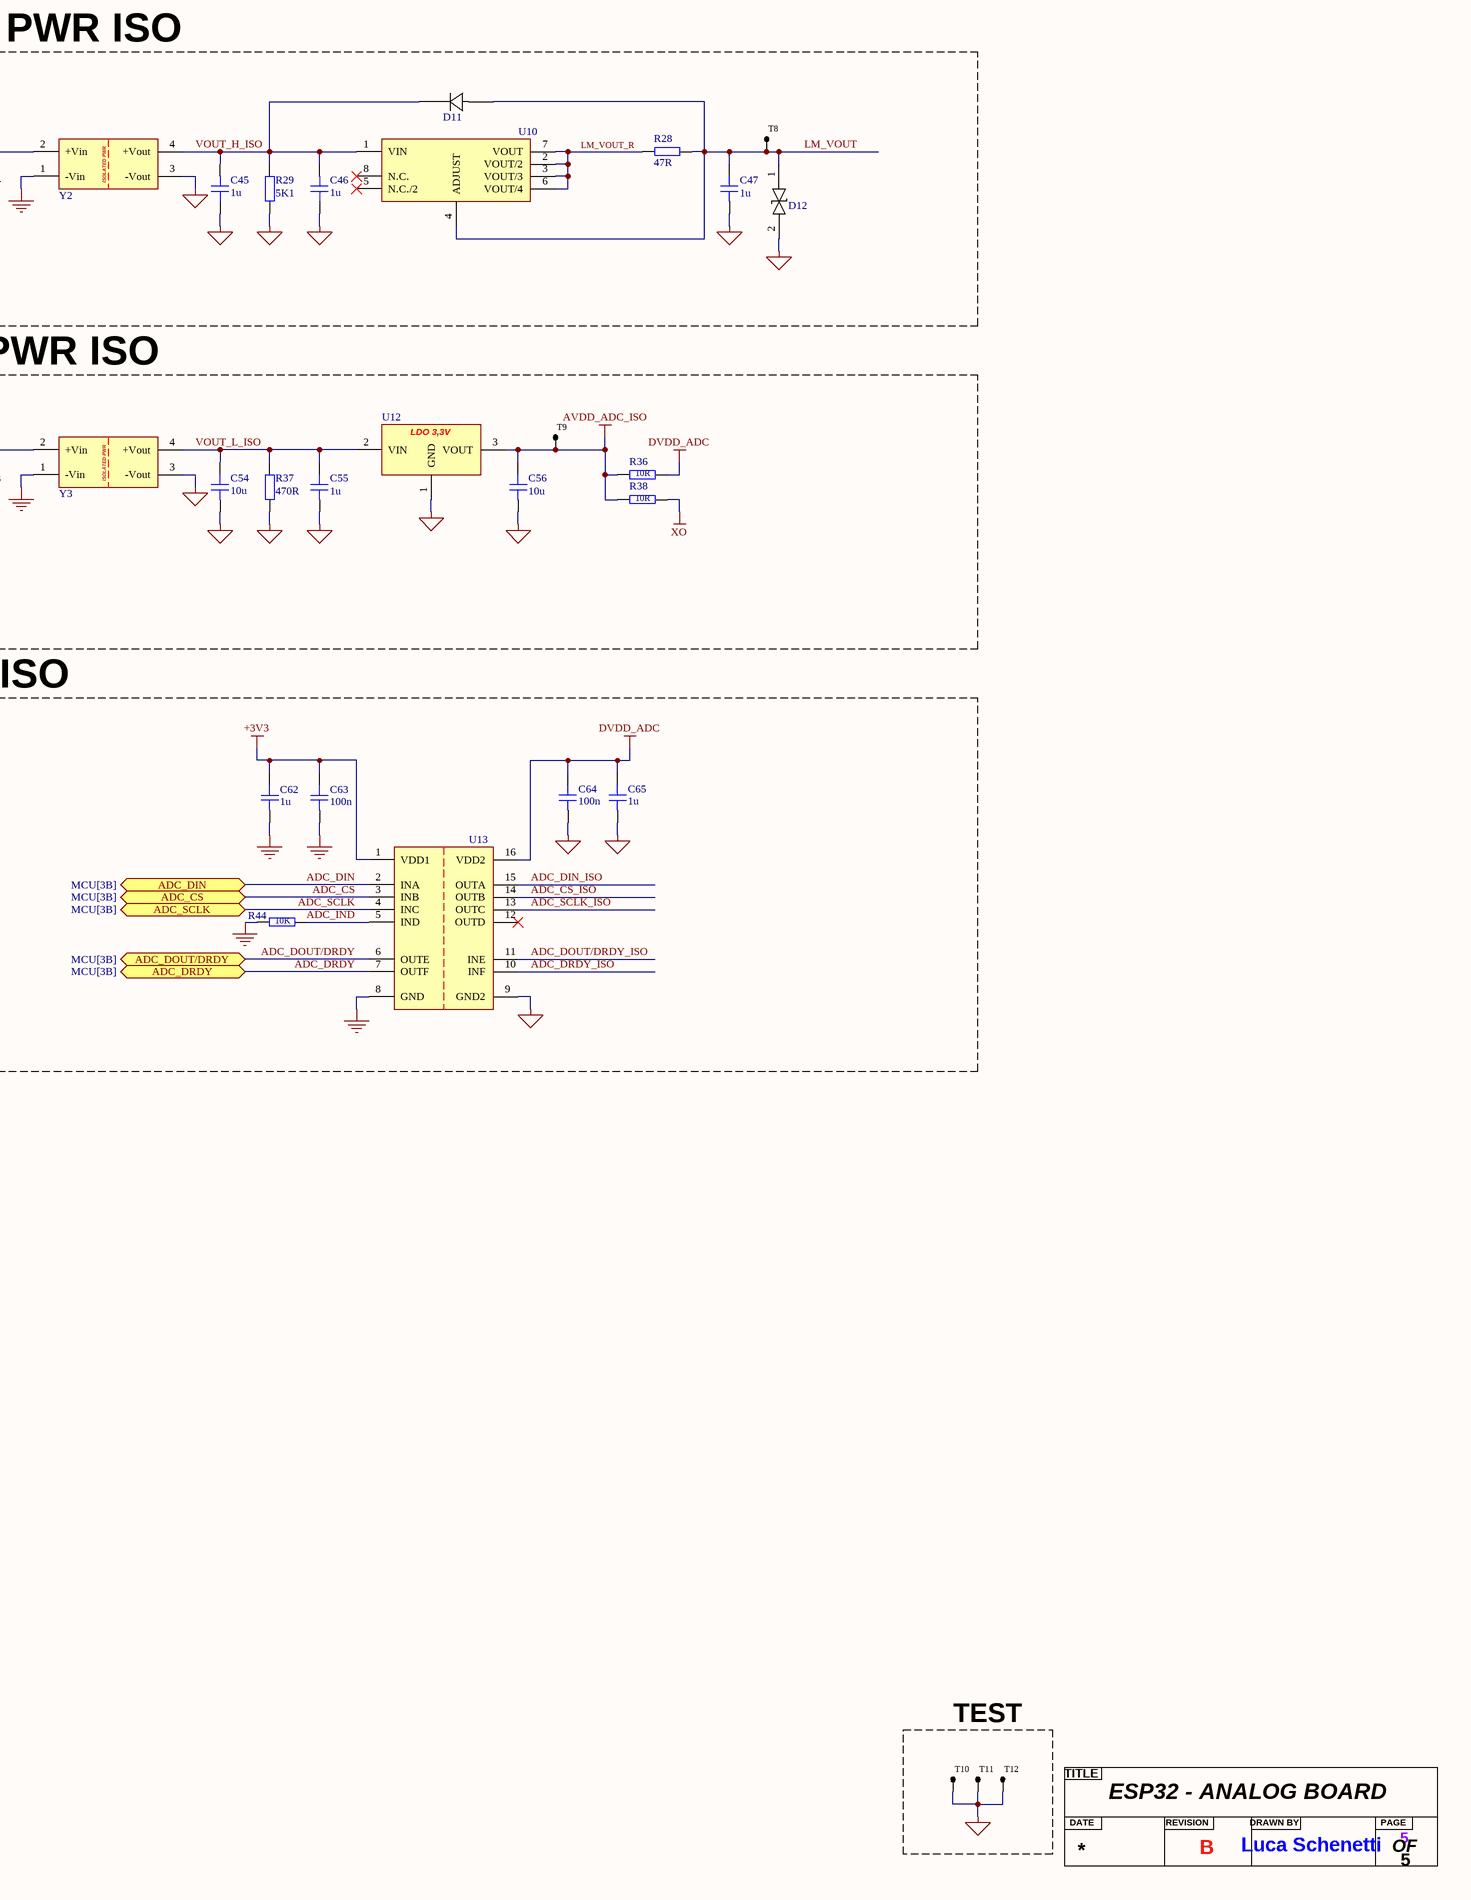
[diagram p10: ADC.SchDoc, right]

### Parts
(Parts that share a designator on the sheet are numbered #1, #2 ... from top to bottom, then left to right.)
?#6  Title  (value not drawn)  (graphical)
C42  10u  [CAP_0402]
C43  100n  [CAP_0402]
C44  1u  [CAP_0805]
C45  1u  [CAP_0805]
C46  1u  [CAP_0805]
C47  1u  [CAP_0805]
C48  10u  [CAP_0402]
C49  100n  [CAP_0402]
C50  2n7  [CAP_0402]
C51  27n  [CAP_0402]
C52  2n7  [CAP_0402]
C53  4u7  [CAP_0805]
C54  10u  [CAP_0805]
C55  1u  [CAP_0603]
C56  10u  [CAP_0603]
C57  10u  [CAP_0402]
C58  100n  [CAP_0402]
C59  1n  [CAP_0402]
C60  10n  [CAP_0402]
C61  1n  [CAP_0402]
C62  1u  [CAP_0402]
C63  100n  [CAP_0402]
C64  100n  [CAP_0402]
C65  1u  [CAP_0402]
D11  DIODE 300mA 75V  [1N4148W]  (value not drawn)
D12  BIDI TVS 36V  [SMAJ33CA]  (value not drawn)
D13  BIDI TVS 36V  [SMAJ33CA]  (value not drawn)
D14  BIDI TVS 36V  [SMAJ33CA]  (value not drawn)
F3  RESETTABLE FUSE 100mA  [BSMD1812-010-60V]  (value not drawn)
P2  WJ500V-5.08-5P  [WJ500V-5.08-5P]  (value not drawn)
R28  47R  [RES_0603]
R29  5K1  [RES_2010]
R30  4K12  [RES_0603]
R31  47R  [RES_0402]
R32  47R  [RES_0402]
R33  47R  [RES_0402]
R34  25R5  [RES_2512]
R35  4K12  [RES_0603]
R36  10R  [RES_0402]
R37  470R  [RES_2010]
R38  10R  [RES_0402]
R39  47R  [RES_0402]
R40  90K9  [RES_0603]
R41  10K  [RES_0402]
R42  10K  [RES_0603]
R43  9K09  [RES_0603]
R44  10K  [RES_0402]
T8  TP_S  [TP 1mm]  (value not drawn)  (no BOM)
T9  TP_S  [TP 1mm]  (value not drawn)  (no BOM)
T10  TP_S  [TP 1mm]  (value not drawn)  (no BOM)
T11  TP_S  [TP 1mm]  (value not drawn)  (no BOM)
T12  TP_S  [TP 1mm]  (value not drawn)  (no BOM)
U10  LDO 100mA 2,2-37V  [LM317LDR2G]  (value not drawn)
U11  ADC 24-Bit 4-Channel  [ADS1220IPWR]  (value not drawn)
U12  LDO 3,3V 250mA  [HT7333-A]  (value not drawn)
U13  Digital Isolators 4 IN - 2 OUT  [NSI8262W1-DSWR]  (value not drawn)
X2  4.096MHz CMOS ±10ppm ±20ppm  [OT32254.096MJBA4SL]  (value not drawn)
Y2  Isolated Power IN 4.5V~5.5V OUT 24V  [B0524S-1WR3]  (value not drawn)
Y3  Isolated Power 21.6V~26.4V  [B0505S-1WR3]  (value not drawn)

### Blocks framed on the sheet
2 - 4 WIRE RECEIVER: C42 C43 C48-C52 C57-C61 D13 D14 F3 R30-R35 R39-R43 U11 X2
24V PWR ISO: C44-C47 D11 D12 R28 R29 T8 U10 Y2
5V PWR ISO: C53-C56 R36-R38 T9 U12 Y3
SPI ISO: C62-C65 R44 U13
CONNECTOR: P2
TEST: T10-T12

### Ports
ADC_CS (bidir, see MCU[3B]), ADC_DIN (bidir, see MCU[3B]), ADC_DOUT/DRDY (bidir, see MCU[3B]), ADC_DRDY (bidir, see MCU[3B]), ADC_SCLK (bidir, see MCU[3B])

### Nets
+3V3: C62.2 C63.2 U13.1(VDD1)
+5V_SYS: C44.2 C53.2 Y2.2(+Vin) Y3.2(+Vin)
AVDD_ADC_ISO: C48.2 C49.2 C56.2 R36.1 R38.1 T9.1 U11.9(REFP0) U11.12(AVDD) U12.3(VOUT)
DVDD_ADC: C42.2 C43.2 C64.2 C65.2 R36.2 U11.13(DVDD) U13.16(VDD2)
GND: C44.1 C53.1 C62.1 C63.1 R44.2 U13.8(GND) Y2.1(-Vin) Y3.1(-Vin)
GND_1: C42.1 C43.1 C45.2 C46.2 C47.1 C48.1 C49.1 C50.2 C52.1 C54.1 C55.1 C56.1 C57.1 C58.1 C59.2 C61.2 C64.1 C65.1 D12.2 D13.2 D14.2 P2.1(V-) P2.3(mA−) R29.1 R34.1 R35.1 R37.1 R41.1 R42.1 R43.1 T10.1 T11.1 T12.1 U11.4(DGND) U11.5(AVSS) U11.8(REFN0) U12.1(GND) U13.9(GND2) X2.2(GND) Y2.3(-Vout) Y3.3(-Vout)
XO: C57.2 C58.2 R38.2 X2.4(VDD)
ADC_CS: U13.3(INB) ; port ADC_CS
ADC_CS_ISO: R32.2 U13.14(OUTB)
ADC_DIN: U13.2(INA) ; port ADC_DIN
ADC_DIN_ISO: R33.2 U13.15(OUTA)
ADC_DOUT/DRDY: U13.6(OUTE) ; port ADC_DOUT/DRDY
ADC_DOUT/DRDY_ISO: U11.15(DOUT/DRDY#) U13.11(INE)
ADC_DRDY: U13.7(OUTF) ; port ADC_DRDY
ADC_DRDY_ISO: U11.14(DRDY#) U13.10(INF)
ADC_IND: R44.1 U13.5(IND)
ADC_SCLK: U13.4(INC) ; port ADC_SCLK
ADC_SCLK_ISO: R31.2 U13.13(OUTC)
AIN0: C50.1 C51.2 R30.2 U11.11(AIN0/REFP1)
AIN0_R: F3.1 R30.1 R34.2
AIN1: C51.1 C52.2 R35.2 U11.10(AIN1)
AIN2: C59.1 C60.2 R40.2 R42.2 U11.7(AIN2)
AIN3: C60.1 C61.1 R43.2 U11.6(AIN3/REFN1)
CLK: R39.2 X2.3(OUT)
CLK_R: R39.1 R41.2 U11.3(CLK)
CS_R: R32.1 U11.2(CS#)
DIN_R: R33.1 U11.16(DIN)
LM_VOUT: C47.2 D11.2(A) D12.1 P2.5(L+) R28.2 T8.1 U10.4(ADJUST)
LM_VOUT_R: R28.1 U10.2(VOUT/2) U10.3(VOUT/3) U10.6(VOUT/4) U10.7(VOUT)
M+: D13.1 F3.2 P2.4(mA+)
SCLK_R: R31.1 U11.1(SCLK)
V+: D14.1 P2.2(V+) R40.1
VOUT_H_ISO: C45.1 C46.1 D11.1(C) R29.2 U10.1(VIN) Y2.4(+Vout)
VOUT_L_ISO: C54.2 C55.2 R37.2 U12.2(VIN) Y3.4(+Vout)

Not connected (* = marked no-connect by the designer): U10 5(N.C./2)* 8(N.C.)*; U13 12(OUTD)*; X2 1(TRI)*

### Notes on the sheet
- (in symbol ADS1220IPWR) ADS1220; 24 bit - delta-sigma ADC
- (in symbol B0505S-1WR3) ISOLATED PWR
- (in symbol B0524S-1WR3) ISOLATED PWR
- (in symbol HT7333-A) LDO 3,3V
- (in symbol OT32254.096MJBA4SL) CMOS; 4,096MHz; OSC; 10PPM
- (in symbol Title) TITLE; DATE; REVISION; DRAWN BY; PAGE; OF

### Library data of the parts
C42 C48 C57 = CAP_0402: [C15525]; Manufacturer: *; Manufacturer Part Number: *; Distributor Link: *; LCSC: *; Rating: *; Dielectric: *
C43 C49 C58 C63 C64 = CAP_0402: [C307331]; Manufacturer: *; Manufacturer Part Number: *; Distributor Link: *; LCSC: *; Rating: *; Dielectric: *
C44-C47 = CAP_0805: [C28323]; Manufacturer: *; Manufacturer Part Number: *; Distributor Link: *; LCSC: *; Rating: *; Dielectric: *
C50 C52 = CAP_0402: [C106251]; Manufacturer: *; Manufacturer Part Number: *; Distributor Link: *; LCSC: *; Rating: *; Dielectric: *
C51 = CAP_0402: [C880636]; Manufacturer: *; Manufacturer Part Number: *; Distributor Link: *; LCSC: *; Rating: *; Dielectric: *
C53 = CAP_0805: [C1779]; Manufacturer: *; Manufacturer Part Number: *; Distributor Link: *; LCSC: *; Rating: *; Dielectric: *
C54 = CAP_0805: [C440198]; Manufacturer: *; Manufacturer Part Number: *; Distributor Link: *; LCSC: *; Rating: *; Dielectric: *
C55 = CAP_0603: [C15849]; Manufacturer: *; Manufacturer Part Number: *; Distributor Link: *; LCSC: *; Rating: *; Dielectric: *
C56 = CAP_0603: [C96446]; Manufacturer: *; Manufacturer Part Number: *; Distributor Link: *; LCSC: *; Rating: *; Dielectric: *
C59 C61 = CAP_0402: [C1523]; Manufacturer: *; Manufacturer Part Number: *; Distributor Link: *; LCSC: *; Rating: *; Dielectric: *
C60 = CAP_0402: [C15195]; Manufacturer: *; Manufacturer Part Number: *; Distributor Link: *; LCSC: *; Rating: *; Dielectric: *
C62 C65 = CAP_0402: [C52923]; Manufacturer: *; Manufacturer Part Number: *; Distributor Link: *; LCSC: *; Rating: *; Dielectric: *
D11 = 1N4148W: [C917030]
D12-D14 = SMAJ33CA: [C19077549]
F3 = BSMD1812-010-60V: [C883137]
P2 = WJ500V-5.08-5P: [C2927513]; Manufacturer: KANGNEX(康奈克斯电气); Symbol: WJ500V-5.08-3P-14-00A; Device: WJ500V-5.08-3P; Add into BOM: yes; Structure: 1x3P; Pitch: 5.08mm; Current Rating (Max): 18A; Voltage Rating (Max): 250V; Wire Gauge - AWG: 14~30; Wire Gauge - mm2: 2.5; Number of PINs Per Row: 3; LCSC Part Name: 5.08mm 1x3P 排数:1 每排P数:3 直插; Supplier Part: C72334; Manufacturer Part: WJ500V-5.08-3P; Supplier Footprint: 插件,P=5.08mm; JLCPCB Part Class: Extended Part; Datasheet: https://atta.szlcsc.com/upload/public/pdf/source/20191225/C72334_8A5EF831D67650233B6B1E3F2BC06274.pdf; Supplier: LCSC; Convert to PCB: yes; Color: Green; Mounting Style: Straight; Number of Pins: 3P; Number of Rows: 1; Operating Temperature Range: -40℃~+105℃
R28 = RES_0603: [C23182]; Manufacturer: *; Manufacturer Part Number: *; Distributor Link: *; LCSC: *
R29 = RES_2010: [C2999618]
R30 R35 = RES_0603: [C23041]; Manufacturer: *; Manufacturer Part Number: *; Distributor Link: *; LCSC: *
R31-R33 R39 = RES_0402: [C25118]; Manufacturer: *; Manufacturer Part Number: *; Distributor Link: *; LCSC: *
R34 = RES_2512: [C2775912]
R36 R38 = RES_0402: [C25077]; Manufacturer: *; Manufacturer Part Number: *; Distributor Link: *; LCSC: *
R37 = RES_2010: [C2933989]
R40 = RES_0603: [C23129]; Manufacturer: *; Manufacturer Part Number: *; Distributor Link: *; LCSC: *
R41 R44 = RES_0402: [C25744]; Manufacturer: *; Manufacturer Part Number: *; Distributor Link: *; LCSC: *
R42 = RES_0603: [C25804]; Manufacturer: *; Manufacturer Part Number: *; Distributor Link: *; LCSC: *
R43 = RES_0603: [C23125]; Manufacturer: *; Manufacturer Part Number: *; Distributor Link: *; LCSC: *
T8-T12 = TP_S: test point
U10 = LM317LDR2G: [C7940]
U11 = ADS1220IPWR: [C48263]
U12 = HT7333-A: [C347191]
U13 = NSI8262W1-DSWR: [C5441133]
X2 = OT32254.096MJBA4SL: [C2831395]
Y2 = B0524S-1WR3: [C7500908]
Y3 = B0505S-1WR3: [C7465178]

## Sheet PWR RAIL.SchDoc: ESP32 - ANALOG BOARD
size A3; DrawnBy: Luca Schenetti; Engineer: Luca Schenetti; Revision: B; SheetNumber: 6; SheetTotal: 5
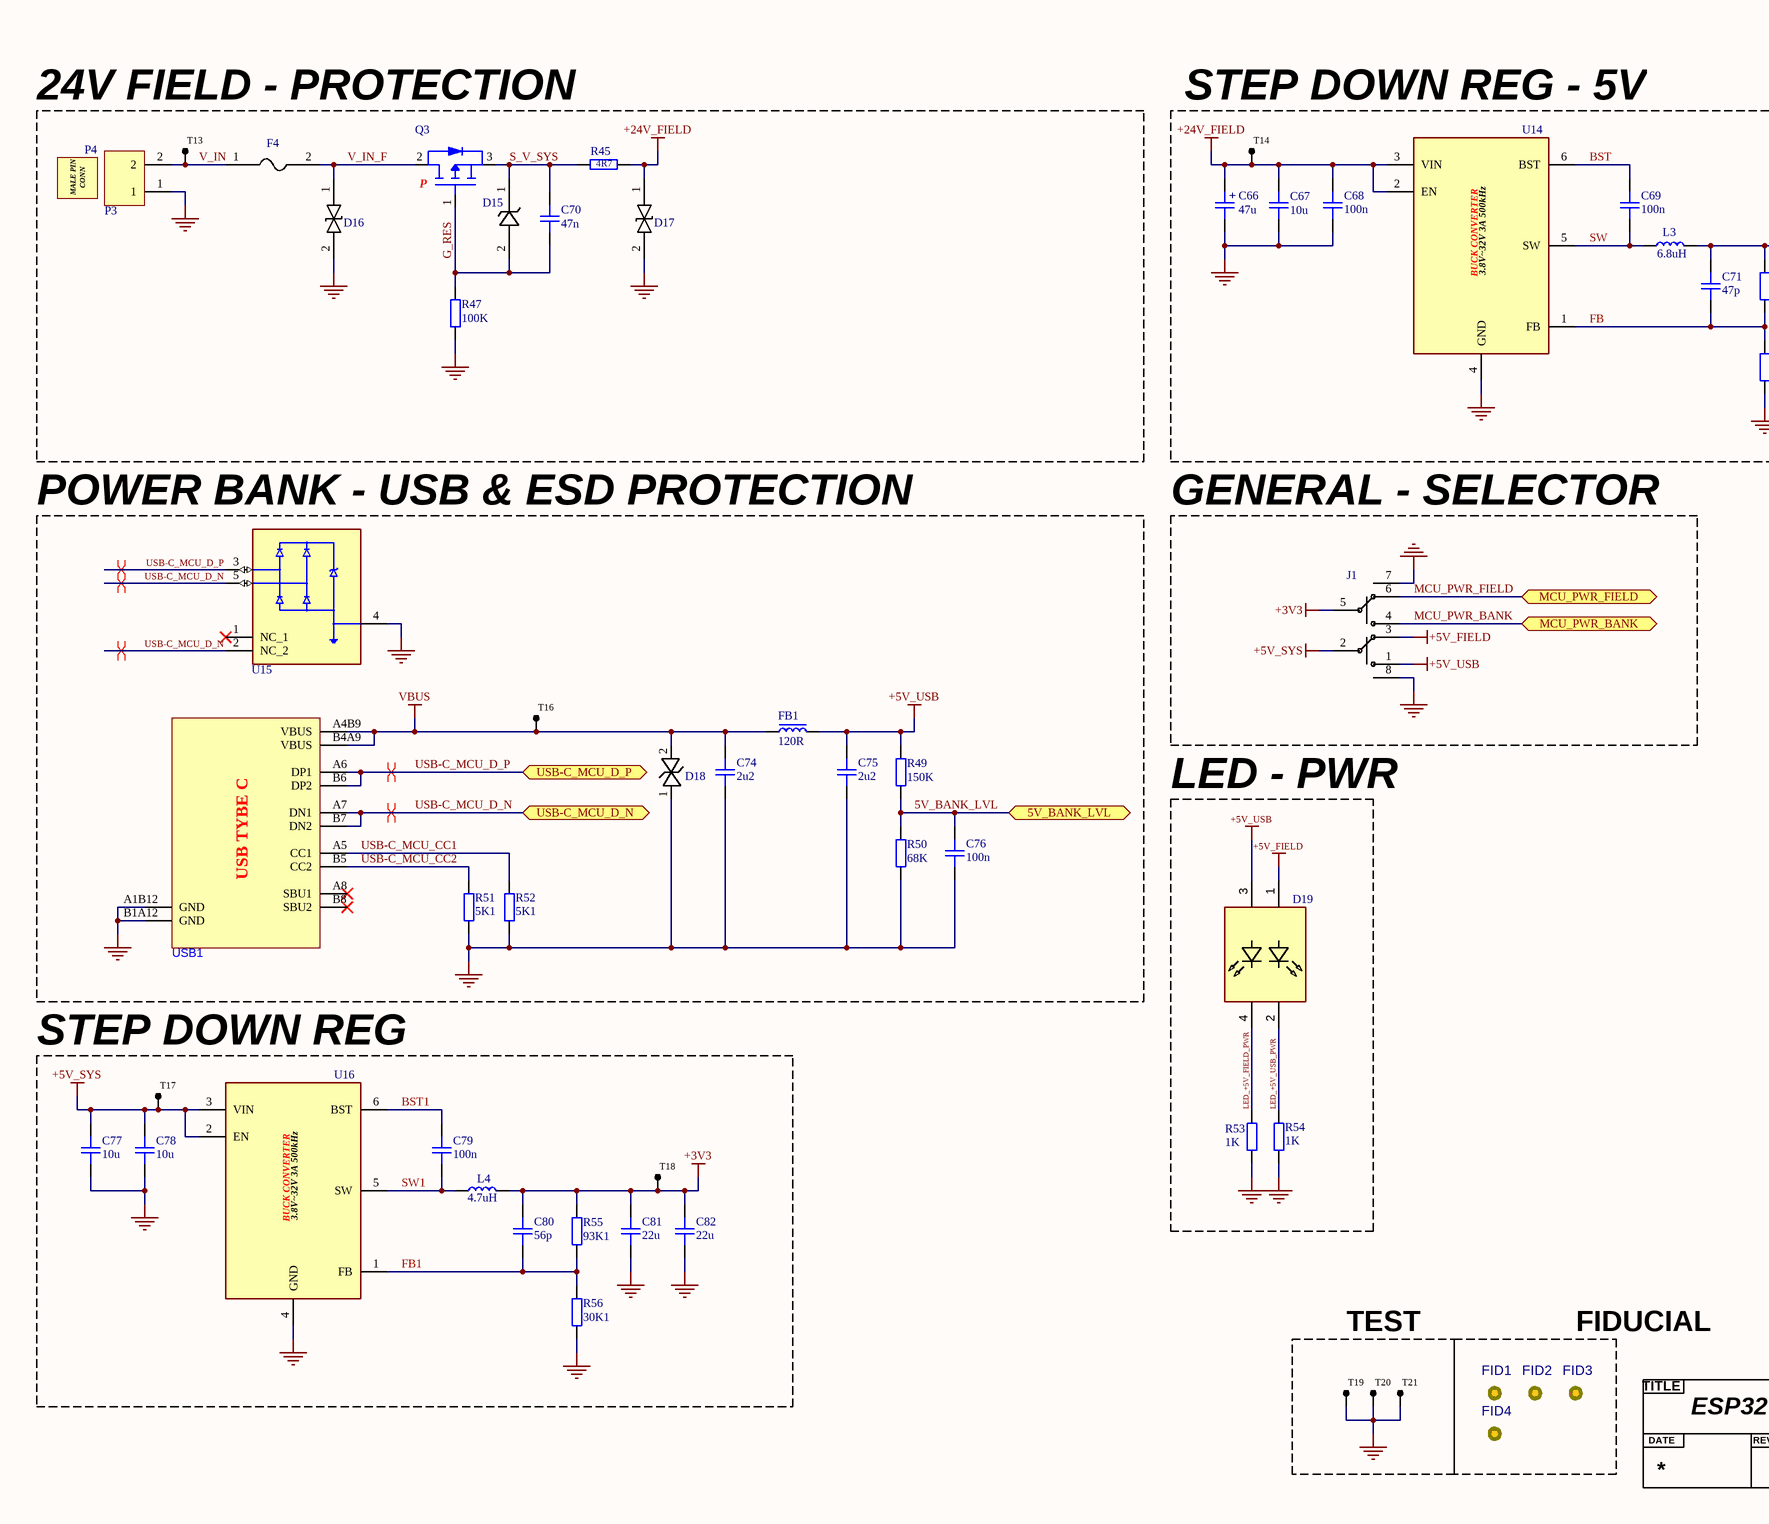
[diagram p11: PWR RAIL.SchDoc, left]
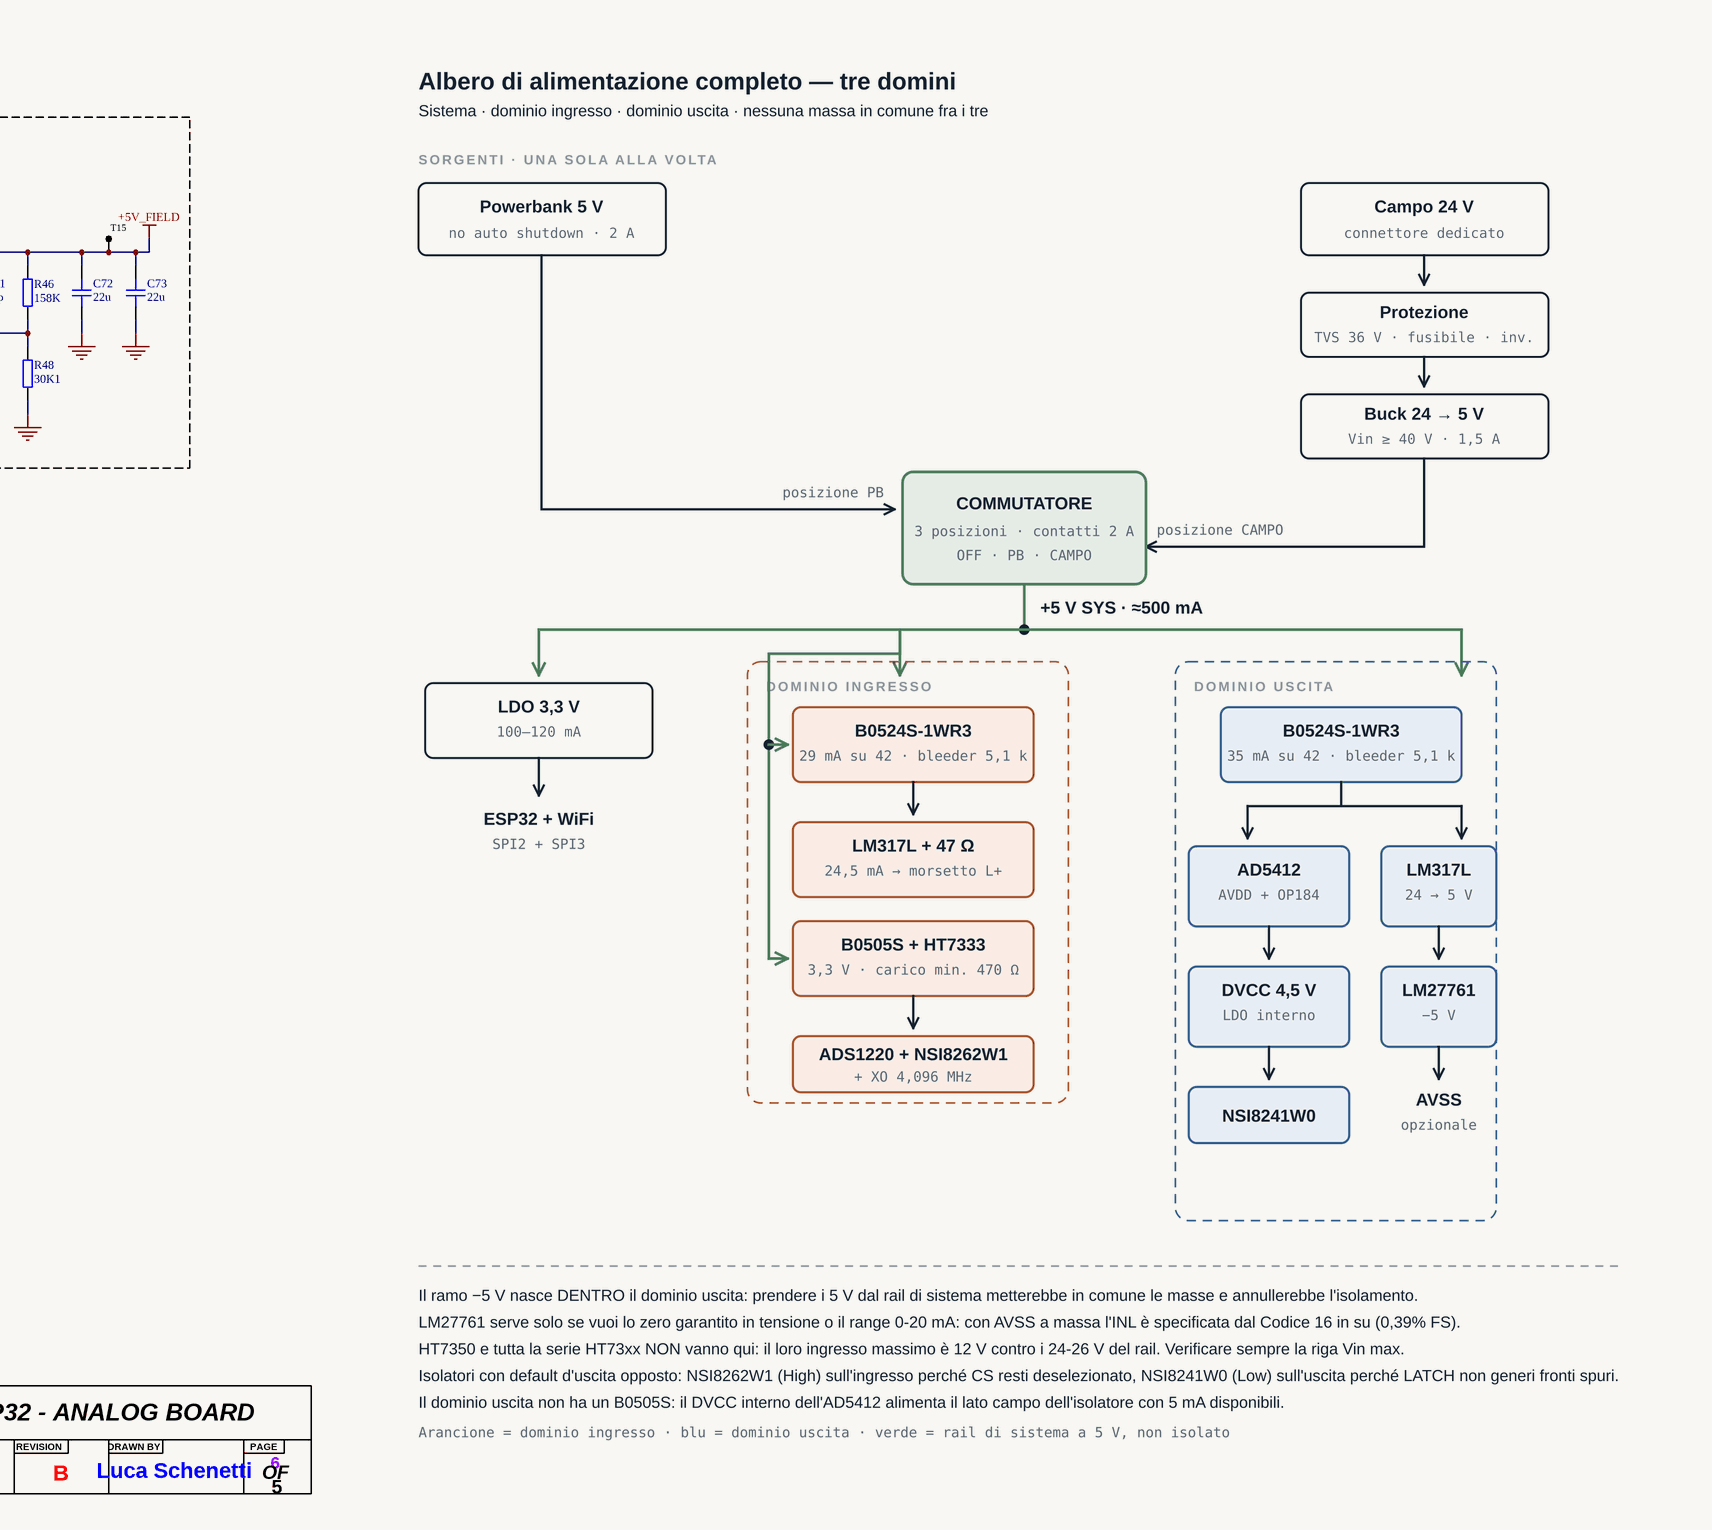
[diagram p12: PWR RAIL.SchDoc, right]

### Parts
(Parts that share a designator on the sheet are numbered #1, #2 ... from top to bottom, then left to right.)
?#7  Title  (value not drawn)  (graphical)
C66  47u  [CAP_ALEL_6.3x5.4]
C67  10u  [CAP_0805]
C68  100n  [CAP_0603]
C69  100n  [CAP_0603]
C70  47n  [CAP_0603]
C71  47p  [CAP_0603]
C72  22u  [CAP_0603]
C73  22u  [CAP_0603]
C74  2u2  [CAP_0402]
C75  2u2  [CAP_0402]
C76  100n  [CAP_0402]
C77  10u  [CAP_0603]
C78  10u  [CAP_0603]
C79  100n  [CAP_0603]
C80  56p  [CAP_0603]
C81  22u  [CAP_0603]
C82  22u  [CAP_0603]
D15  ZENER DIODE 15V  [BZT52C15]  (value not drawn)
D16  BIDI TVS 30V  [SMAJ30CA]  (value not drawn)
D17  BIDI TVS 30V  [SMAJ30CA]  (value not drawn)
D18  ESD Protection TVS 6.0V  [SMF6.0CA]  (value not drawn)
D19  TWO LED GREEN  [TJ-L3F2LTQYKMQFLC7K-A5]  (value not drawn)
F4  PTC 60V 500mA  [mSMD050-60V]  (value not drawn)
FB1  120R  [FB_0402]
FID1  FIDUCIAL  [FIDUCIAL]  (value not drawn)  (no BOM)
FID2  FIDUCIAL  [FIDUCIAL]  (value not drawn)  (no BOM)
FID3  FIDUCIAL  [FIDUCIAL]  (value not drawn)  (no BOM)
FID4  FIDUCIAL  [FIDUCIAL]  (value not drawn)  (no BOM)
J1  DPDT  [2MD3T2B1M6RES]  (value not drawn)
L3  6.8uH  [FXL0530-6R8-M]
L4  4.7uH  [IND-SMD_L4.4-W4.2]
P3  2P PLUGGABLE TERMINAL BLOCK 3.81MM  [WJ15EDGRC-3.81-2P]  (value not drawn)
P4  MALE CONN 2P 3.81mm  [WJ15EDGK-3.81-2P]  (value not drawn)
Q3  P-Mosfet 60V 3A  [BSP315P]  (value not drawn)
R45  4R7  [RES_2512]
R46  158K  [RES_0603]
R47  100K  [RES_0603]
R48  30K1  [RES_0603]
R49  150K  [RES_0402]
R50  68K  [RES_0402]
R51  5K1  [RES_0402]
R52  5K1  [RES_0402]
R53  1K  [RES_0402]
R54  1K  [RES_0402]
R55  93K1  [RES_0603]
R56  30K1  [RES_0603]
T13  TP_S  [TP 1mm]  (value not drawn)  (no BOM)
T14  TP_S  [TP 1mm]  (value not drawn)  (no BOM)
T15  TP_S  [TP 1mm]  (value not drawn)  (no BOM)
T16  TP_S  [TP 1mm]  (value not drawn)  (no BOM)
T17  TP_S  [TP 1mm]  (value not drawn)  (no BOM)
T18  TP_S  [TP 1mm]  (value not drawn)  (no BOM)
T19  TP_S  [TP 1mm]  (value not drawn)  (no BOM)
T20  TP_S  [TP 1mm]  (value not drawn)  (no BOM)
T21  TP_S  [TP 1mm]  (value not drawn)  (no BOM)
U14  3.8V~32V 3A 500kHz  [AP63301WU-7]  (value not drawn)
U15  TVS USB 2.0 ±25-kV  [TPD2E2U06DRLR]  (value not drawn)
U16  3.8V~32V 3A 500kHz  [AP63301WU-7]  (value not drawn)
USB1  USB-C CONNECTOR 16P VERTICAL  [TYPEC-305-ACP16H458]  (value not drawn)

### Blocks framed on the sheet
24V FIELD - PROTECTION: C70 D15-D17 F4 P3 P4 Q3 R45 R47 T13
STEP DOWN REG - 5V: C66-C69 C71-C73 L3 R46 R48 T14 T15 U14
POWER BANK - USB & ESD PROTECTION: C74-C76 D18 FB1 R49-R52 T16 U15 USB1
GENERAL - SELECTOR: J1
LED - PWR: D19 R53 R54
STEP DOWN REG: C77-C82 L4 R55 R56 T17 T18 U16
TEST: T19-T21
FIDUCIAL: FID1-FID4

### Ports
5V_BANK_LVL (bidir, see MCU[3B]), MCU_PWR_BANK (bidir, see MCU[3B]), MCU_PWR_FIELD (bidir, see MCU[3B]), USB-C_MCU_D_N (bidir, see MCU[3B]), USB-C_MCU_D_P (bidir, see MCU[3B])

### Nets
+3V3: C80.2 C81.2 C82.2 J1.5 L4.2 R55.2 T18.1
+5V_FIELD: C71.2 C72.2 C73.2 D19.1(A1) J1.3 L3.2 R46.2 T15.1
+5V_SYS: C77.2 C78.2 J1.2 T17.1 U16.2(EN) U16.3(VIN)
+5V_USB: C75.2 D19.3(B1) FB1.2 J1.1 R49.2
+24V_FIELD: C66.1 C67.2 C68.2 D17.1 R45.2 T14.1 U14.2(EN) U14.3(VIN)
GND: C66.2 C67.1 C68.1 C72.1 C73.1 C74.1 C75.1 C76.1 C77.1 C78.1 C81.1 C82.1 D16.2 D17.2 D18.1 J1.7 J1.8 P3.1 R47.1 R48.1 R50.1 R51.1 R52.1 R53.1 R54.1 R56.1 T19.1 T20.1 T21.1 U14.4(GND) U15.4(GND) U16.4(GND) USB1.A1B12(GND) USB1.B1A12(GND)
VBUS: C74.2 D18.2 FB1.1 T16.1 USB1.A4B9(VBUS) USB1.B4A9(VBUS)
5V_BANK_LVL: C76.2 R49.1 R50.2 ; port 5V_BANK_LVL
BST: C69.2 U14.6(BST)
BST1: C79.2 U16.6(BST)
FB: C71.1 R46.1 R48.2 U14.1(FB)
FB1: C80.1 R55.1 R56.2 U16.1(FB)
G_RES: C70.1 D15.2(A) Q3.1(G) R47.2
LED_+5V_FIELD_PWR: D19.4(B2) R53.2
LED_+5V_USB_PWR: D19.2(A2) R54.2
MCU_PWR_BANK: J1.4 ; port MCU_PWR_BANK
MCU_PWR_FIELD: J1.6 ; port MCU_PWR_FIELD
S_V_SYS: C70.2 D15.1(K) Q3.3(S) R45.1
SW: C69.1 L3.1 U14.5(SW)
SW1: C79.1 L4.1 U16.5(SW)
USB-C_MCU_CC1: R52.2 USB1.A5(CC1)
USB-C_MCU_CC2: R51.2 USB1.B5(CC2)
USB-C_MCU_D_N: U15.2(NC_2) U15.5(IO2) USB1.A7(DN1) USB1.B7(DN2) ; port USB-C_MCU_D_N
USB-C_MCU_D_P: U15.3(IO1) USB1.A6(DP1) USB1.B6(DP2) ; port USB-C_MCU_D_P
V_IN: F4.1 P3.2 T13.1
V_IN_F: D16.1 F4.2 Q3.2(D)

Not connected (* = marked no-connect by the designer): U15 1(NC_1)*; USB1 A8(SBU1)* B8(SBU2)*

### Layout directives
differential pair; differential pair class DIFF_USB_90Ω: USB-C_MCU_D_N, USB-C_MCU_D_P

### Notes on the sheet
- (in symbol AP63301WU-7) BUCK CONVERTER
- (in symbol BSP315P) P
- (in symbol CAP_ALEL_6.3x5.4) +
- (in symbol Title) TITLE; DATE; REVISION; DRAWN BY; PAGE; OF
- (in symbol TYPEC-305-ACP16H458) USB TYBE C
- (in symbol WJ15EDGK-3.81-2P) MALE PIN; CONN

### Library data of the parts
C66 = CAP_ALEL_6.3x5.4: [C48971023]; Manufacturer: *; Manufacturer Part Number: *; Distributor Link: *; LCSC: *
C67 = CAP_0805: [C440198]; Manufacturer: *; Manufacturer Part Number: *; Distributor Link: *; LCSC: *; Rating: *; Dielectric: *
C68 C69 C79 = CAP_0603: [C14663]; Manufacturer: *; Manufacturer Part Number: *; Distributor Link: *; LCSC: *; Rating: *; Dielectric: *
C70 = CAP_0603: [C1622]; Manufacturer: *; Manufacturer Part Number: *; Distributor Link: *; LCSC: *; Rating: *; Dielectric: *
C71 = CAP_0603: [C1671]; Manufacturer: *; Manufacturer Part Number: *; Distributor Link: *; LCSC: *; Rating: *; Dielectric: *
C72 C73 C81 C82 = CAP_0603: [C59461]; Manufacturer: *; Manufacturer Part Number: *; Distributor Link: *; LCSC: *; Rating: *; Dielectric: *
C74 C75 = CAP_0402: [C12530]; Manufacturer: *; Manufacturer Part Number: *; Distributor Link: *; LCSC: *; Rating: *; Dielectric: *
C76 = CAP_0402: [C307331]; Manufacturer: *; Manufacturer Part Number: *; Distributor Link: *; LCSC: *; Rating: *; Dielectric: *
C77 C78 = CAP_0603: [C194427]; Manufacturer: *; Manufacturer Part Number: *; Distributor Link: *; LCSC: *; Rating: *; Dielectric: *
C80 = CAP_0603: [C39148]; Manufacturer: *; Manufacturer Part Number: *; Distributor Link: *; LCSC: *; Rating: *; Dielectric: *
D15 = BZT52C15: [C19077412]
D16 D17 = SMAJ30CA: [C10755]
D18 = SMF6.0CA: [C123791]
D19 = TJ-L3F2LTQYKMQFLC7K-A5: [C20613347]
F4 = mSMD050-60V: [C70113]
FB1 = FB_0402: [C76891]; Manufacturer: *; Manufacturer Part Number: *; Distributor Link: *; LCSC: *
J1 = 2MD3T2B1M6RES: [C545196]
L3 = FXL0530-6R8-M: [C177249]
L4 = IND-SMD_L4.4-W4.2: [C5349668]
P3 = WJ15EDGRC-3.81-2P: [C8387]
P4 = WJ15EDGK-3.81-2P: [C8466]
Q3 = BSP315P: [C5246415]
R45 = RES_2512: [C25489]
R46 = RES_0603: [C22883]; Manufacturer: *; Manufacturer Part Number: *; Distributor Link: *; LCSC: *
R47 = RES_0603: [C25803]; Manufacturer: *; Manufacturer Part Number: *; Distributor Link: *; LCSC: *
R48 R56 = RES_0603: [C137745]; Manufacturer: *; Manufacturer Part Number: *; Distributor Link: *; LCSC: *
R49 = RES_0402: [C93947]; Manufacturer: *; Manufacturer Part Number: *; Distributor Link: *; LCSC: *
R50 = RES_0402: [C2909379]; Manufacturer: *; Manufacturer Part Number: *; Distributor Link: *; LCSC: *
R51 R52 = RES_0402: [C25905]; Manufacturer: *; Manufacturer Part Number: *; Distributor Link: *; LCSC: *
R53 R54 = RES_0402: [C11702]; Manufacturer: *; Manufacturer Part Number: *; Distributor Link: *; LCSC: *
R55 = RES_0603: [C23266]; Manufacturer: *; Manufacturer Part Number: *; Distributor Link: *; LCSC: *
T13-T21 = TP_S: test point
U14 U16 = AP63301WU-7: [C2158003]
U15 = TPD2E2U06DRLR: [C1972959]
USB1 = TYPEC-305-ACP16H458: [C5454943]; Manufacturer: XKB Connectivity(中国星坤); Symbol: U262-16XN-4BVC11; Device: U262-161N-4BVC11; Add into BOM: yes; Connector Type: Type-C; Gender: Female; Number of Ports: 1; Current Rating - Power (Max): 3A; Soldering Temperature(Max): 260℃; LCSC Part Name: Type-C 母 卧贴; Supplier Part: C319148; Manufacturer Part: U262-161N-4BVC11; Supplier Footprint: SMD; JLCPCB Part Class: Extended Part; Datasheet: https://atta.szlcsc.com/upload/public/pdf/source/20211015/B478CBA0F1623DA36A6CC6918C49C838.pdf; Supplier: LCSC; Convert to PCB: yes; Standard: USB 3.1; Number of Contacts: 16P; Mounting Style: 卧贴; Contact Material: Copper Alloy; Contact Plating: Gold; Operating Temperature Range: -40℃~+85℃
FID1-FID4 = FIDUCIAL: Revision: 0; Description_: FIDUCIAL; DNP: DNP

## Nets that join several sheets
+3V3: MCU (21 pins), DAC (C32.2 C33.2 U9.1), ADC (C62.2 C63.2 U13.1), PWR RAIL (7 pins)
+5V_SYS: DAC (C24.2 Y1.1), ADC (C44.2 C53.2 Y2.2 Y3.2), PWR RAIL (6 pins)
GND: MCU (29 pins), DAC (5 pins), ADC (8 pins), PWR RAIL (34 pins)
2_WIRE_T_EN: MCU (U3.43), DAC (U9.5)
5V_BANK_LVL: MCU (U3.6), PWR RAIL (C76.2 R49.1 R50.2)
ADC_CS: MCU (U3.18), ADC (U13.3)
ADC_DIN: MCU (U3.19), ADC (U13.2)
ADC_DOUT/DRDY: MCU (U3.16), ADC (U13.6)
ADC_DRDY: MCU (U3.15), ADC (U13.7)
ADC_SCLK: MCU (U3.17), ADC (U13.4)
DAC_FAULT: MCU (U3.9), DAC (U9.7)
DAC_LATCH: MCU (U3.13), DAC (U9.2)
DAC_SCLK: MCU (U3.12), DAC (U9.3)
DAC_SDIN: MCU (U3.11), DAC (U9.4)
DAC_SDO: MCU (U3.10), DAC (U9.6)
MCU_PWR_BANK: MCU (U3.24), PWR RAIL (J1.4)
MCU_PWR_FIELD: MCU (U3.23), PWR RAIL (J1.6)
USB-C_MCU_D_N: MCU (U3.25), PWR RAIL (U15.2 U15.5 USB1.A7 USB1.B7)
USB-C_MCU_D_P: MCU (U3.26), PWR RAIL (U15.3 USB1.A6 USB1.B6)